# Altium project Z35.PrjPcb
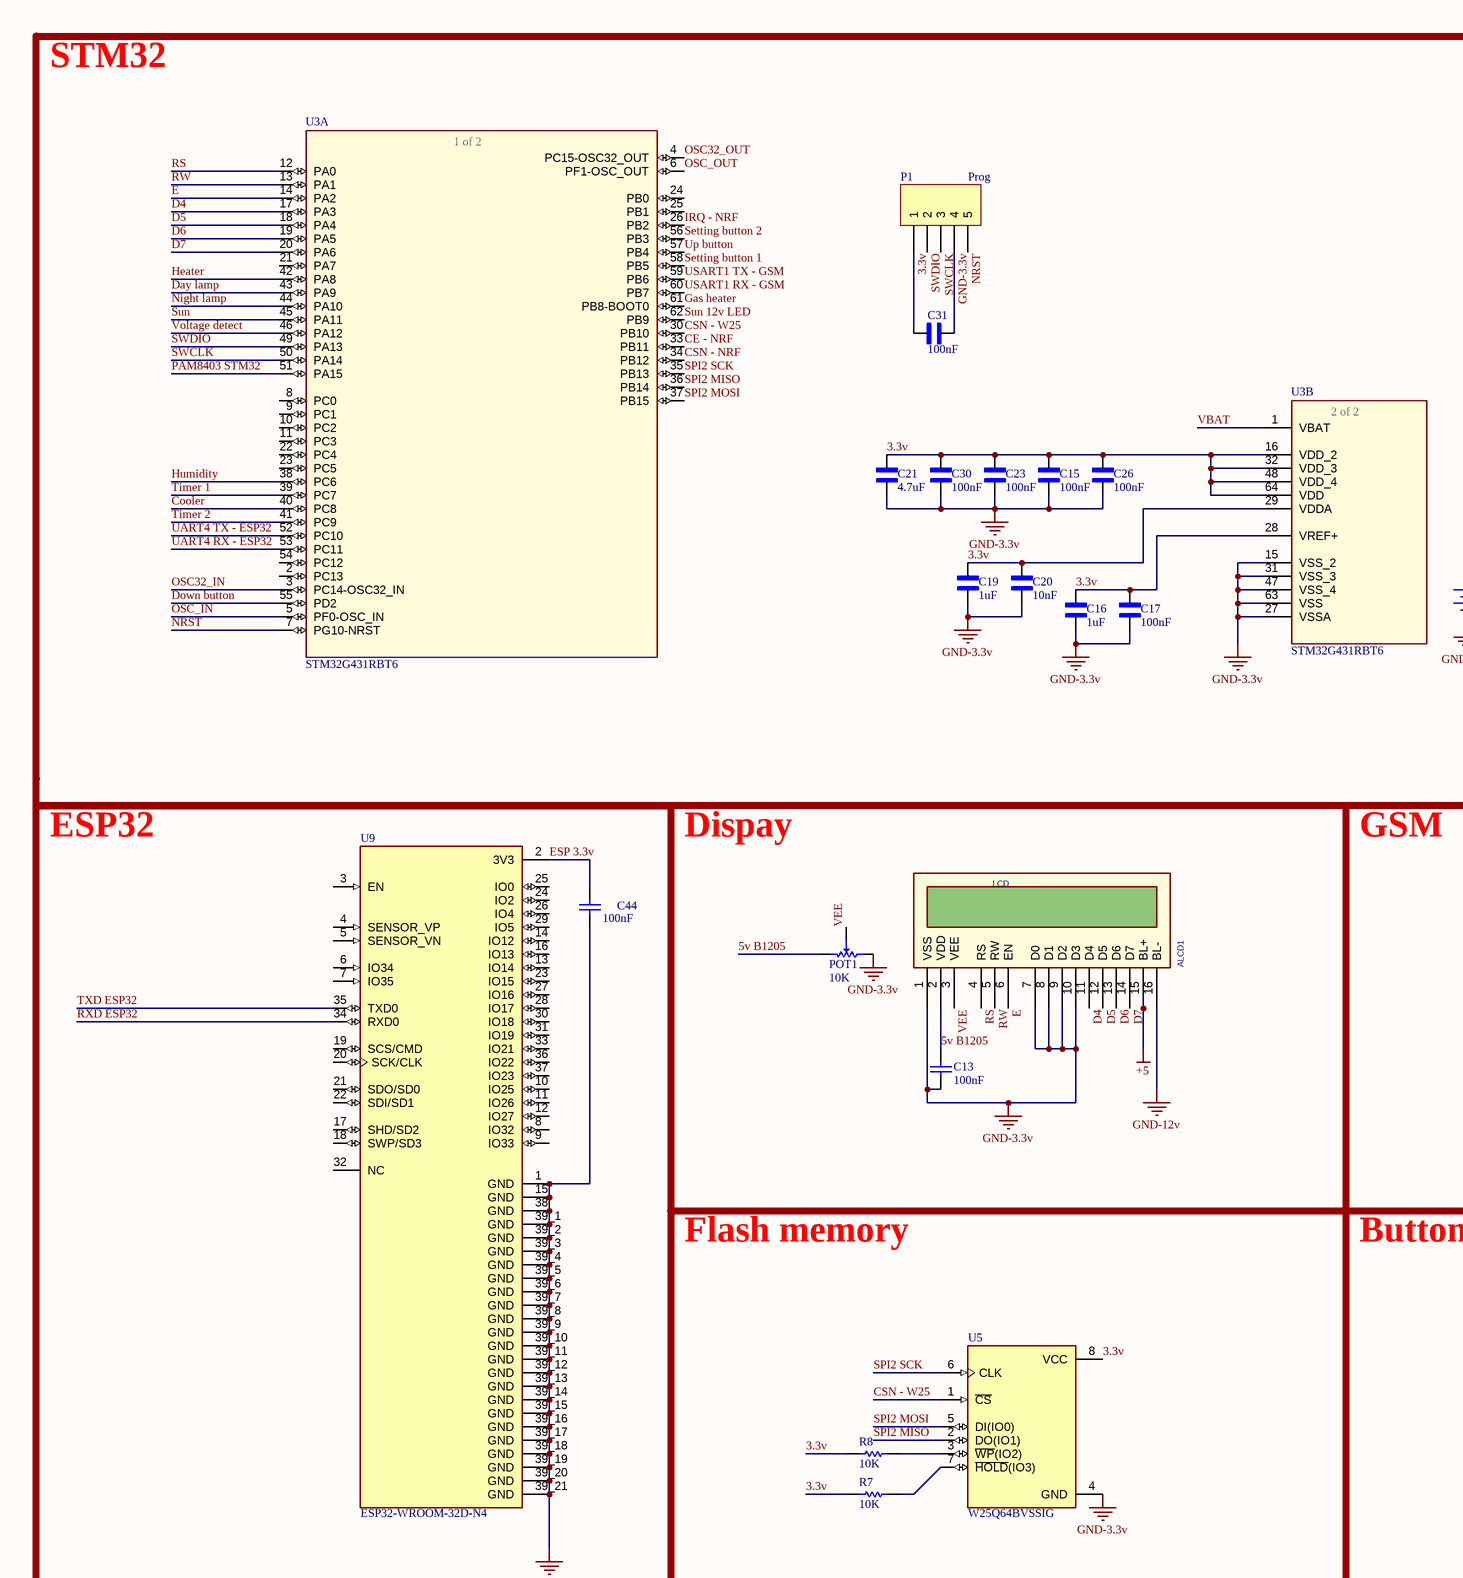
[diagram p0: Sch_Z35.SchDoc, top left]
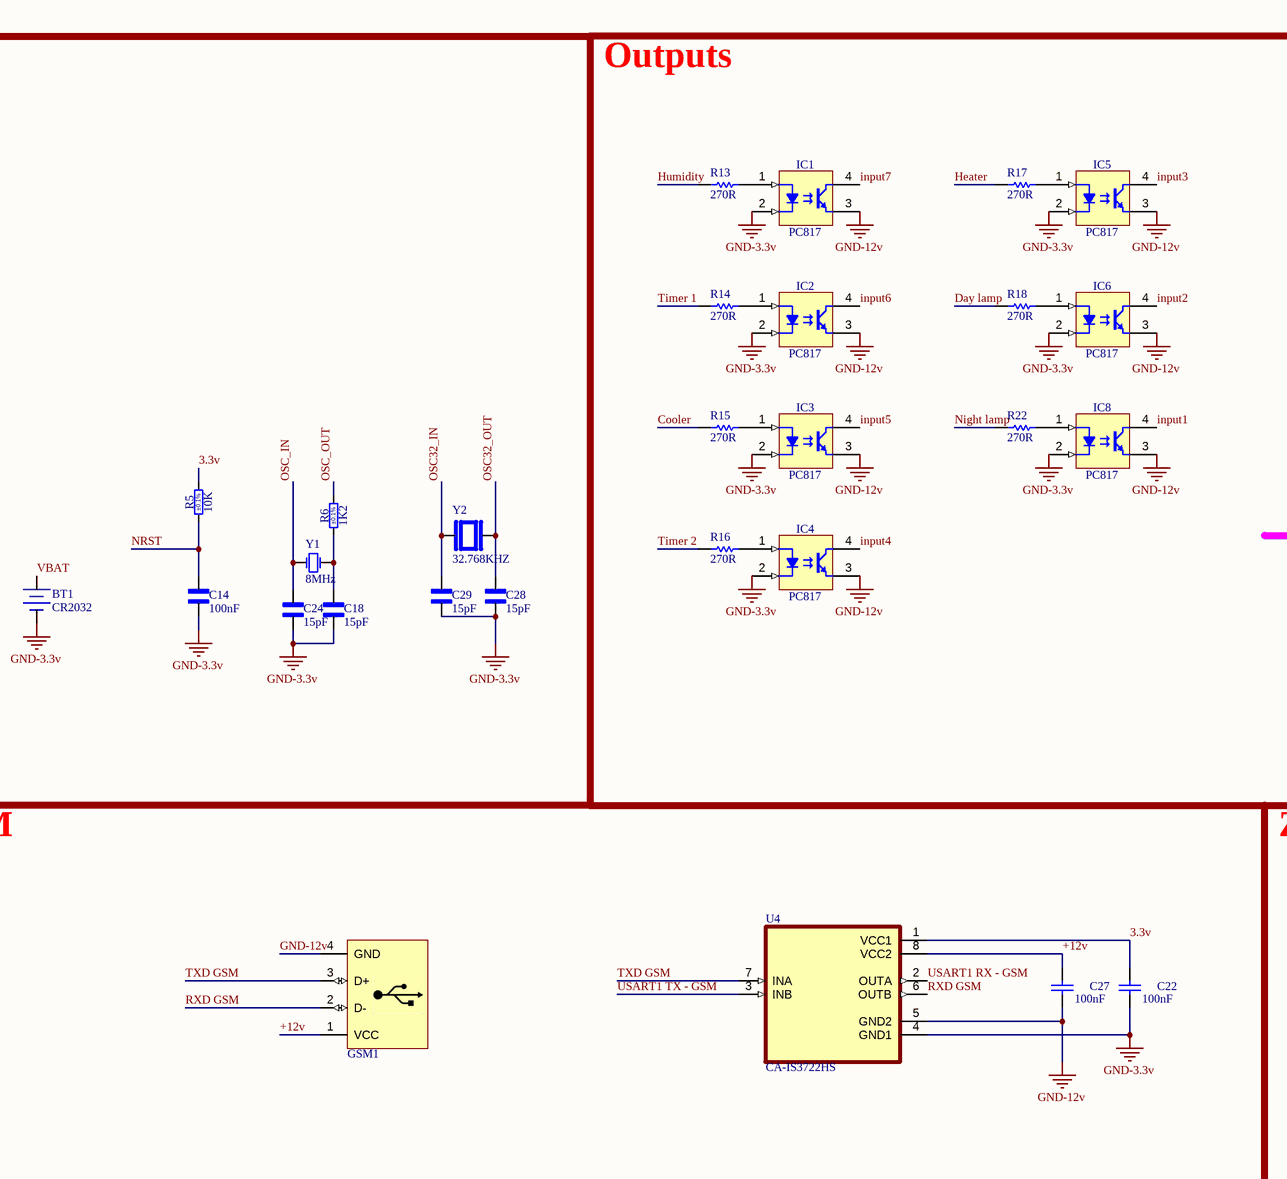
[diagram p1: Sch_Z35.SchDoc, top middle]
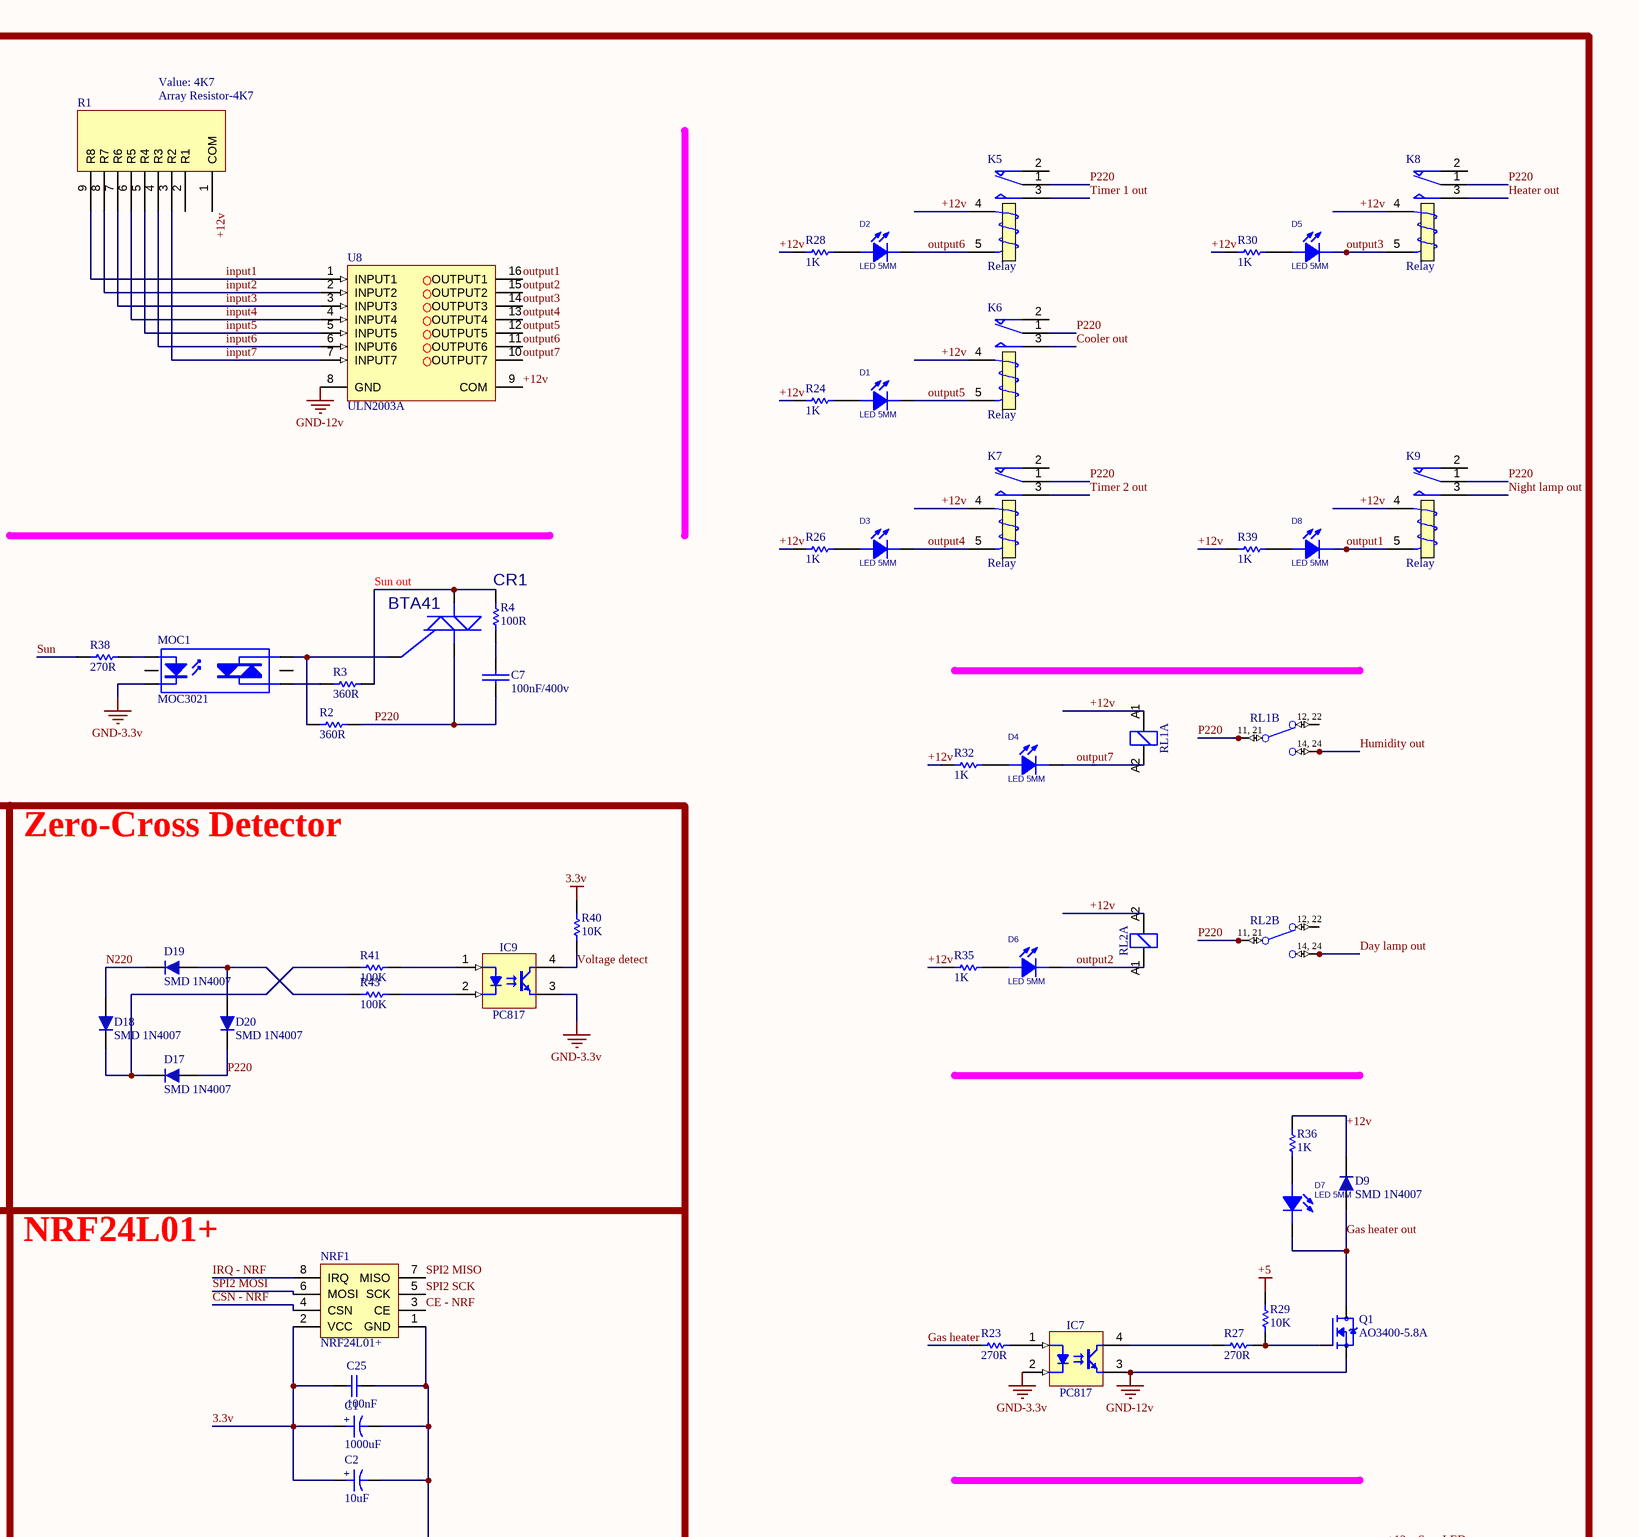
[diagram p2: Sch_Z35.SchDoc, top right]
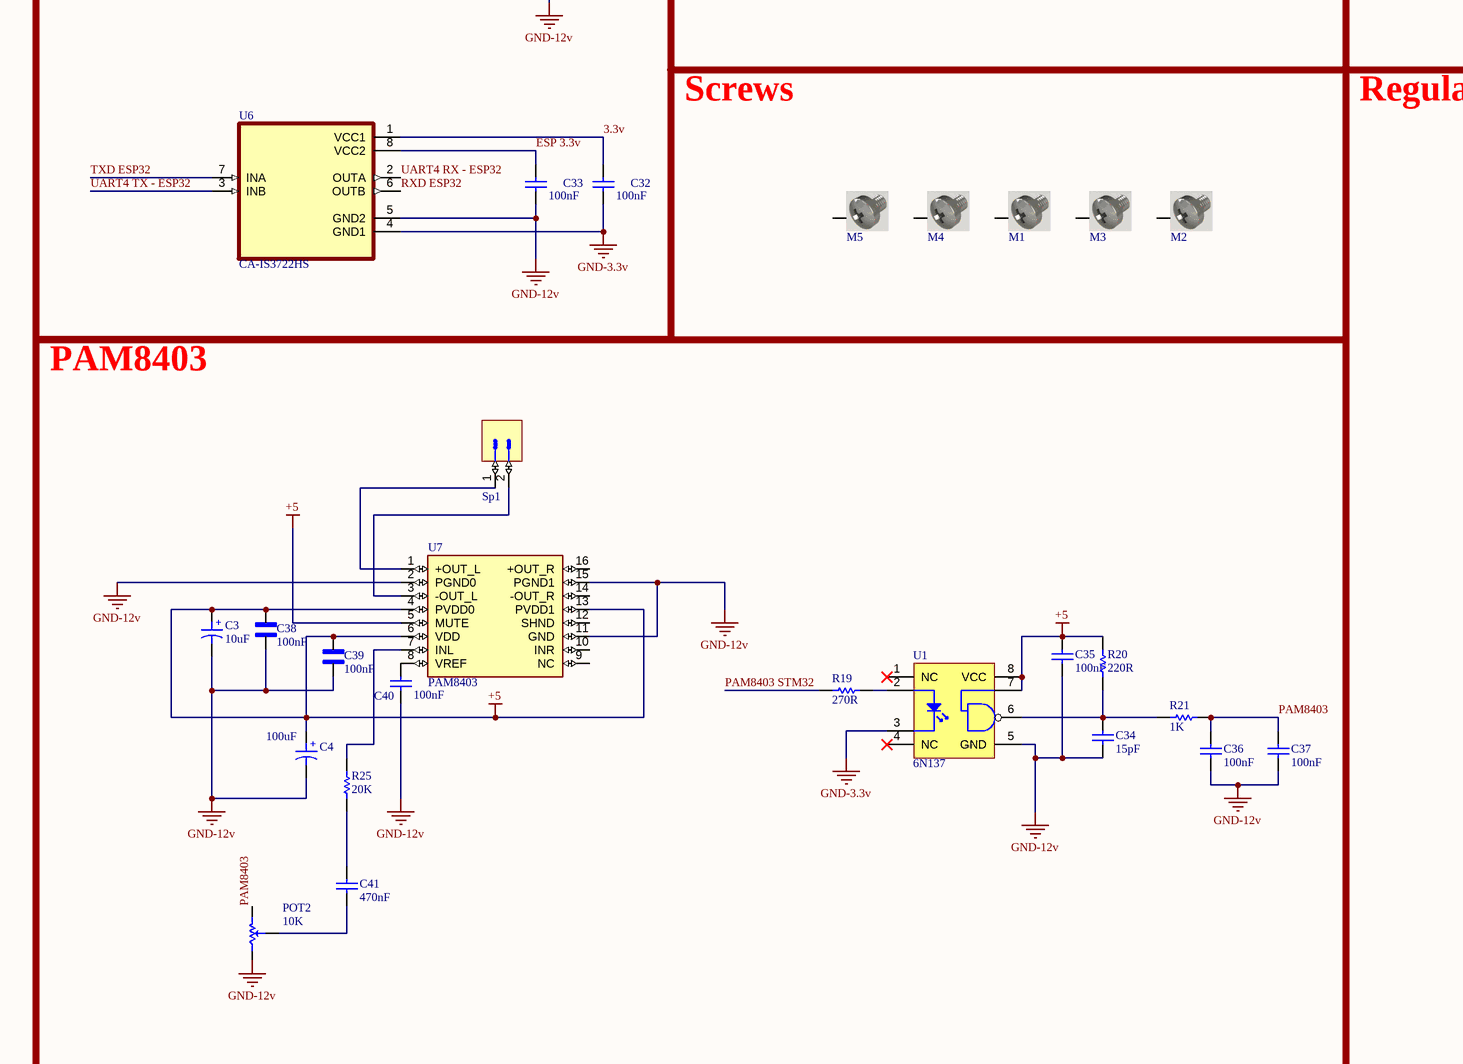
[diagram p3: Sch_Z35.SchDoc, bottom left]
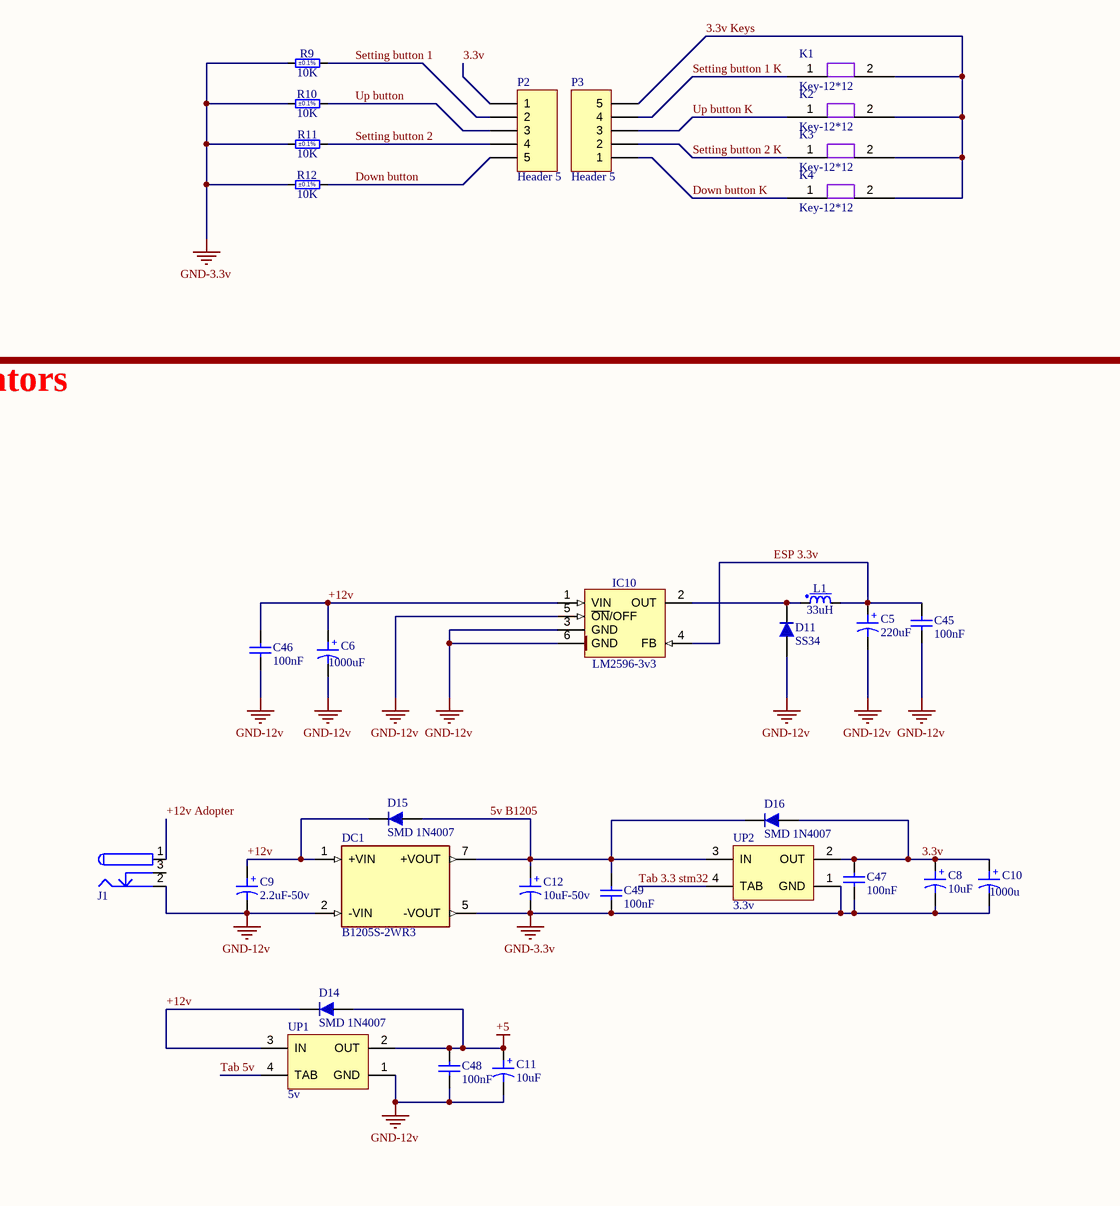
[diagram p4: Sch_Z35.SchDoc, bottom middle]
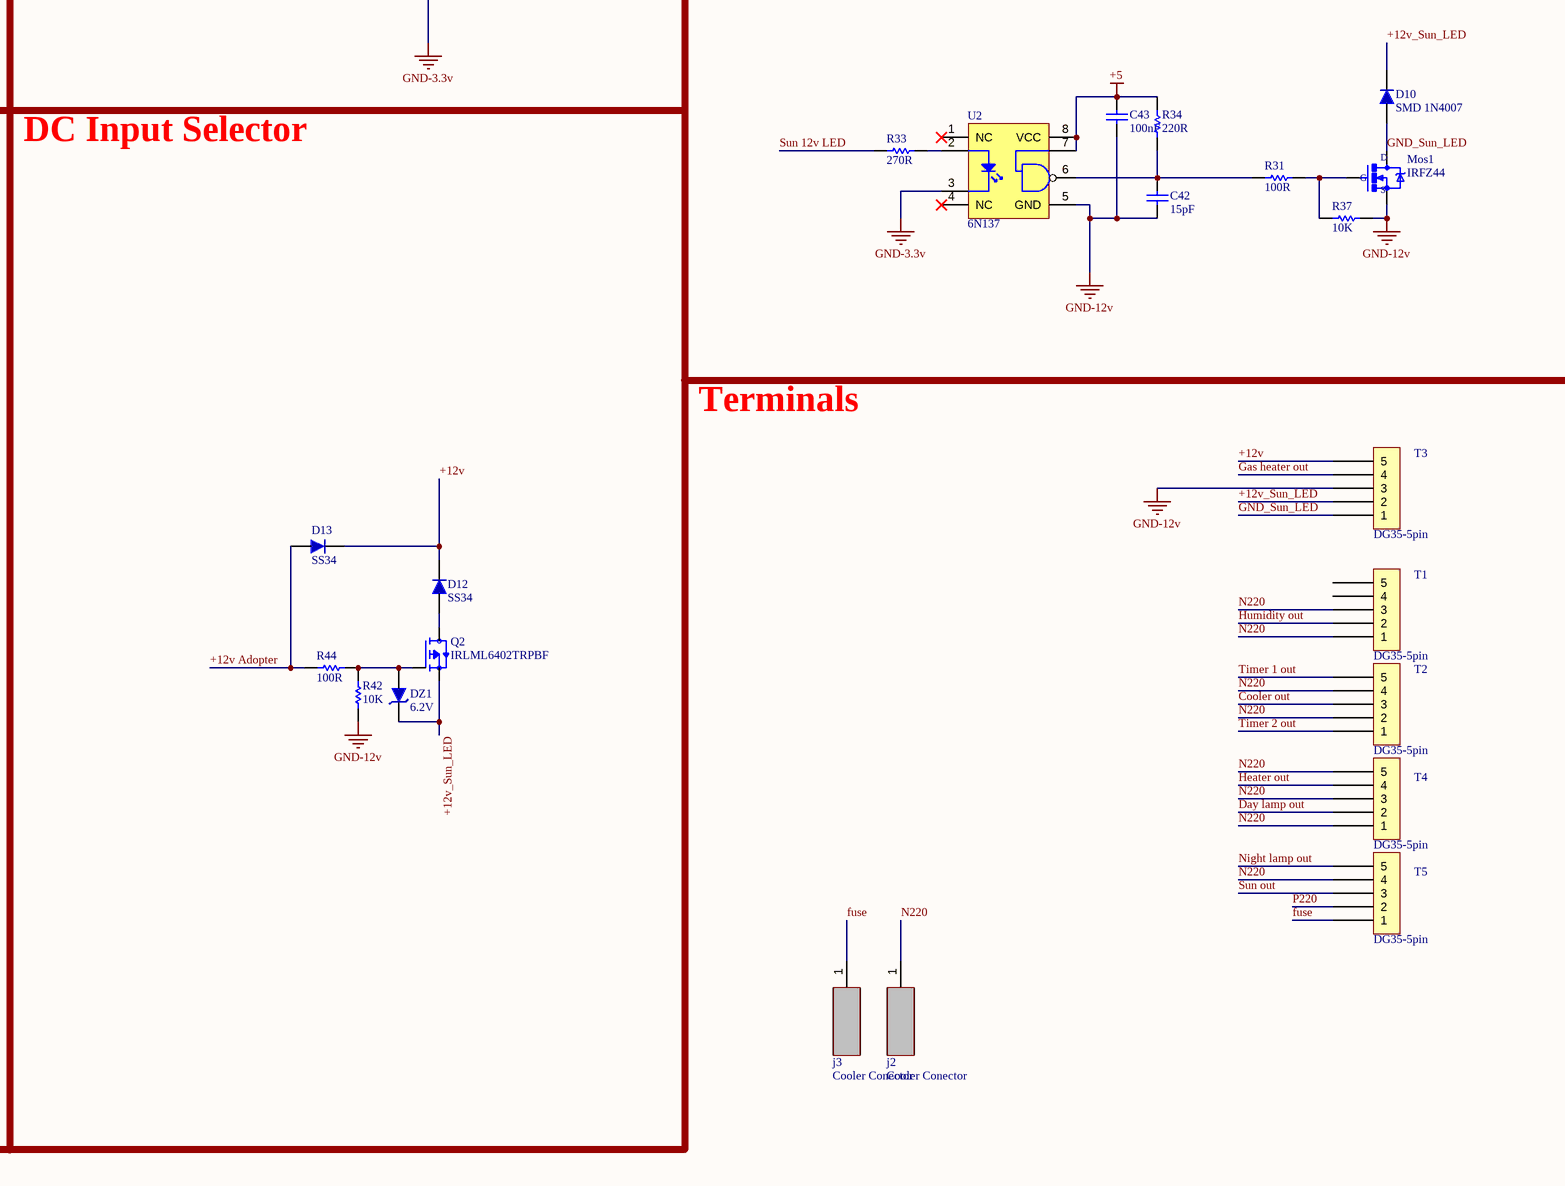
[diagram p5: Sch_Z35.SchDoc, bottom right]
Designer: Mohammadreza Zourmand
3 sheets, 279 parts. Net scope: global (net labels, ports and power ports of the same name join across sheets).
Board files: PCB_Z35.PcbDoc, PCB_Z35_Wireless_board.PcbDoc, PCB_Z35_Sensors.PcbDoc
Sheets:
  Sch_Z35.SchDoc
  Sch_Z35_Wireless_board.SchDoc
  Sch_Z35_Sensors.SchDoc

## Sheet Sch_Z35.SchDoc: Z35
size D; Author: Mohammadreza Zourmand; CompanyName: Daya; DrawnBy: Mohammadreza Zourmand; Engineer: Mohammadreza Zourmand; SheetNumber: 1; SheetTotal: 3; ProjectName: Birds Training

### Parts
(Parts that share a designator on the sheet are numbered #1, #2 ... from top to bottom, then left to right.)
ALCD1  LCD  [LCD 16x2]
BT1  CR2032  [BAT BACKUP]
C1  1000uF  [Cap electrolitic radial 8x14-3.5]
C2  10uF  [Cap electrolitic radial 6.3x12-2.5]
C3  10uF  [Cap electrolitic radial 4x7-1.5]
C4  100uF  [Cap electrolitic radial 4x7-1.5]
C5  220uF  [Cap electrolitic radial 6.3x12-2.5]
C6  1000uF  [Cap electrolitic radial 8x14-3.5]
C7  100nF/400v  [Cap - 100nF - 400V]
C8  10uF  [Cap electrolitic radial 6.3x12-2.5]
C9  2.2uF-50v  [Cap electrolitic radial 4x7-1.5]
C10  1000u  [Cap electrolitic radial 8x14-3.5]
C11  10uF  [Cap electrolitic radial 6.3x12-2.5]
C12  10uF-50v  [Cap electrolitic radial 4x7-1.5]
C13  100nF  [CAPC3413X12N]
C14  100nF  [CAPC1608X90]
C15  100nF  [CAPC1608X90]
C16  1uF  [CAPC1608X90]
C17  100nF  [CAPC1608X90]
C18  15pF  [CAPC1608X90]
C19  1uF  [CAPC1608X90]
C20  10nF  [CAPC1608X90]
C21  4.7uF  [CAPC1608X90]
C22  100nF  [CAPC3413X12N]
C23  100nF  [CAPC1608X90]
C24  15pF  [CAPC1608X90]
C25  100nF  [CAPC3413X12N]
C26  100nF  [CAPC1608X90]
C27  100nF  [CAPC3413X12N]
C28  15pF  [CAPC1608X90]
C29  15pF  [CAPC1608X90]
C30  100nF  [CAPC1608X90]
C31  100nF  [CAPC1608X90]
C32  100nF  [CAPC3413X12N]
C33  100nF  [CAPC3413X12N]
C34  15pF  [CAPC3413X12N]
C35  100nF  [CAPC3413X12N]
C36  100nF  [CAPC3413X12N]
C37  100nF  [CAPC3413X12N]
C38  100nF  [CAPC1608X90]
C39  100nF  [CAPC1608X90]
C40  100nF  [CAPC3413X12N]
C41  470nF  [CAPC3413X12N]
C42  15pF  [CAPC3413X12N]
C43  100nF  [CAPC3413X12N]
C44  100nF  [CAPC3413X12N]
C45  100nF  [CAPC3413X12N]
C46  100nF  [CAPC3413X12N]
C47  100nF  [CAPC3413X12N]
C48  100nF  [CAPC3413X12N]
C49  100nF  [CAPC3413X12N]
CR1  BTA41  [BTA41]
D1  LED 5MM  [LED5MM_YELLOW]
D2  LED 5MM  [LED5MM_YELLOW]
D3  LED 5MM  [LED5MM_YELLOW]
D4  LED 5MM  [LED5MM_YELLOW]
D5  LED 5MM  [LED5MM_YELLOW]
D6  LED 5MM  [LED5MM_YELLOW]
D7  LED 5MM  [LED5MM_YELLOW]
D8  LED 5MM  [LED5MM_YELLOW]
D9  SMD 1N4007  [DIODE SMD]
D10  SMD 1N4007  [DIODE SMD]
D11  SS34  [DIODE SMD]
D12  SS34  [DIODE SMD]
D13  SS34  [DIODE SMD]
D14  SMD 1N4007  [DIODE SMD]
D15  SMD 1N4007  [DIODE SMD]
D16  SMD 1N4007  [DIODE SMD]
D17  SMD 1N4007  [DIODE SMD]
D18  SMD 1N4007  [DIODE SMD]
D19  SMD 1N4007  [DIODE SMD]
D20  SMD 1N4007  [DIODE SMD]
DC1  B1205S-2WR3  [CONV_RKZE-1205S/HP]
DZ1  6.2V  [SOD80, LL-34]
GSM1  USB Connector  [USB2.5-2H4C]  (value not drawn)
IC1  PC817  [WURTH_140817143400]
IC2  PC817  [WURTH_140817143400]
IC3  PC817  [WURTH_140817143400]
IC4  PC817  [WURTH_140817143400]
IC5  PC817  [WURTH_140817143400]
IC6  PC817  [WURTH_140817143400]
IC7  PC817  [WURTH_140817143400]
IC8  PC817  [WURTH_140817143400]
IC9  PC817  [WURTH_140817143400]
IC10  LM2596-3v3  [TO170P1435X465-6N-R1041X635]
J1  DC Power Jack  [DC Power Jack 1]  (value not drawn)
j2  Cooler Conector  [Cooler Conector]
j3  Cooler Conector  [Cooler Conector]
K1  Key-12*12  [Switch_11_11]
K2  Key-12*12  [Switch_11_11]
K3  Key-12*12  [Switch_11_11]
K4  Key-12*12  [Switch_11_11]
K5  Relay  [Relay 18.85x15.35x15.70]
K6  Relay  [Relay 18.85x15.35x15.70]
K7  Relay  [Relay 18.85x15.35x15.70]
K8  Relay  [Relay 18.85x15.35x15.70]
K9  Relay  [Relay 18.85x15.35x15.70]
L1  33uH  [IND_PANASONIC_ELL6RH]
M1  Screw3mm  [Board Screw 3mm]  (value not drawn)
M2  Screw3mm  [Board Screw 3mm]  (value not drawn)
M3  Screw3mm  [Board Screw 3mm]  (value not drawn)
M4  Screw3mm  [Board Screw 3mm]  (value not drawn)
M5  Screw3mm  [Board Screw 3mm]  (value not drawn)
MOC1  MOC3021  [DIP-6]
Mos1  IRFZ44  [TO-220]
NRF1  NRF24L01+  [NRF24L01P]
P1  Prog  [HDR1X5]
P2  Header 5  [HDR1X5]
P3  Header 5  [HDR1X5]
POT1  10K  [POT 4]
POT2  10K  [POT 4]
Q1#1  AO3400-5.8A  [SOT95P260X140-3N]
Q2  IRLML6402TRPBF  [SOT95P237X112-3N]
R1  Array Resistor-4K7  value 4K7  [Res Array]
R2  360R  [Axial 0_25 W, 0_4 IN LEAD PITCH]
R3  360R  [Axial 0_25 W, 0_4 IN LEAD PITCH]
R4  100R  [Axial 0_25 W, 0_4 IN LEAD PITCH]
R5  10K  Tolerance: ±0.1%  [RESC1608X55N]
R6  1K2  Tolerance: ±0.1%  [RESC1608X55N]
R7  10K  [RESC3413X04N]
R8  10K  [RESC3413X04N]
R9  10K  Tolerance: ±0.1%  [RESC1608X55N]
R10  10K  Tolerance: ±0.1%  [RESC1608X55N]
R11  10K  Tolerance: ±0.1%  [RESC1608X55N]
R12  10K  Tolerance: ±0.1%  [RESC1608X55N]
R13  270R  [RESC3413X04N]
R14  270R  [RESC3413X04N]
R15  270R  [RESC3413X04N]
R16  270R  [RESC3413X04N]
R17  270R  [RESC3413X04N]
R18  270R  [RESC3413X04N]
R19  270R  [RESC3413X04N]
R20  220R  [RESC3413X04N]
R21  1K  [RESC3413X04N]
R22  270R  [RESC3413X04N]
R23  270R  [RESC3413X04N]
R24  1K  [RESC4817X04N]
R25  20K  [RESC3413X04N]
R26  1K  [RESC4817X04N]
R27  270R  [RESC3413X04N]
R28  1K  [RESC4817X04N]
R29  10K  [RESC3413X04N]
R30  1K  [RESC4817X04N]
R31  100R  [RESC3413X04N]
R32  1K  [RESC4817X04N]
R33  270R  [RESC3413X04N]
R34  220R  [RESC3413X04N]
R35  1K  [RESC4817X04N]
R36  1K  [RESC4817X04N]
R37  10K  [RESC3413X04N]
R38  270R  [RESC3413X04N]
R39  1K  [RESC4817X04N]
R40  10K  [RESC3413X04N]
R41  100K  [RESC4817X04N]
R42  10K  [RESC3413X04N]
R43  100K  [RESC4817X04N]
R44  100R  [RESC3413X04N]
RL1  REL_FINDER_40.61  [REL_FINDER_40.61]  (value not drawn)  (parts A,B of 2)
RL2  REL_FINDER_40.61  [REL_FINDER_40.61]  (value not drawn)  (parts A,B of 2)
Sp1  KK®  [MOLEX_22-04-1021]  (value not drawn)
T1  DG35-5pin  [DG35-5pin]
T2  DG35-5pin  [DG35-5pin]
T3  DG35-5pin  [DG35-5pin]
T4  DG35-5pin  [DG35-5pin]
T5  DG35-5pin  [DG35-5pin]
U1  6N137  [DIP8]
U2  6N137  [DIP8]
U3  STM32G431RBT6  [LQFP64-10X10MM]  (parts A,B of 2)
U4  CA-IS3722HS  [SOIC127P599X175-8N]
U5  W25Q64BVSSIG  [SOIC127P790X216-8N]
U6  CA-IS3722HS  [SOIC127P599X175-8N]
U7  PAM8403  [SOP-16]
U8  ULN2003A  [SO16_M]
U9  ESP32-WROOM-32D-N4  [MODULE_ESP32-WROOM-32D-N4]
UP1  5v  [SOT223]
UP2  3.3v  [SOT223]
Y1  8MHz  [Crystal SMD]
Y2  32.768KHZ  [XTAL_ABS09-32.768KHZ-T]

### Blocks framed on the sheet
ESP32: C32 C33 C44 U6 U9

### Nets
3.3v: C1.1 C2.1 C8.1 C10.1 C15.1 C16.1 C17.1 C19.1 C20.1 C21.1 C22.1 C23.1 C25.2 C26.1 C30.1 C31.1 C32.1 C47.1 D16.1 NRF1.2(VCC) P1.1 P2.1 R5.2 R7.2 R8.2 R40.1 U3.16(VDD_2) U3.28(VREF+) U3.29(VDDA) U3.32(VDD_3) U3.48(VDD_4) U3.64(VDD) U4.1(VCC1) U5.8(VCC) U6.1(VCC1) UP2.2(OUT)
+5: ALCD1.15(BL+) C3.1 C4.1 C11.1 C35.1 C38.1 C39.1 C43.1 C48.1 D14.1 R20.2 R29.2 R34.2 U1.7(Ve) U1.8(VCC) U2.7(Ve) U2.8(VCC) U7.4(PVDD0) U7.5(MUTE) U7.6(VDD) U7.13(PVDD1) UP1.2(OUT)
GND-3.3v: ALCD1.1(VSS) ALCD1.7(D0) ALCD1.8(D1) ALCD1.9(D2) ALCD1.10(D3) BT1.2(-) C1.2 C2.2 C8.2 C10.2 C12.2 C13.2 C14.2 C15.2 C16.2 C17.2 C18.2 C19.2 C20.2 C21.2 C22.2 C23.2 C24.2 C25.1 C26.2 C28.2 C29.2 C30.2 C31.2 C32.2 C47.2 C49.2 DC1.5(-VOUT) IC1.2(C) IC2.2(C) IC3.2(C) IC4.2(C) IC5.2(C) IC6.2(C) IC7.2(C) IC8.2(C) IC9.3(E) MOC1.2(K) NRF1.1(GND) P1.4 POT1.1(CCW) R9.1 R10.1 R11.1 R12.1 U1.3(K) U2.3(K) U3.15(VSS_2) U3.27(VSSA) U3.31(VSS_3) U3.47(VSS_4) U3.63(VSS) U4.4(GND1) U5.4(GND) U6.4(GND1) UP2.1(GND)
GND-12v: ALCD1.16(BL-) C3.2 C4.2 C5.2 C6.2 C9.2 C11.2 C27.2 C33.2 C34.2 C35.2 C36.2 C37.2 C38.2 C39.2 C40.2 C42.2 C43.2 C44.2 C45.2 C46.2 C48.2 D11.1 DC1.2(-VIN) GSM1.4(GND) IC1.3(E) IC2.3(E) IC3.3(E) IC4.3(E) IC5.3(E) IC6.3(E) IC7.3(E) IC8.3(E) IC10.3(GND) IC10.5(~{ON}/OFF) IC10.6(GND) J1.2 Mos1.3(S) POT2.1(CCW) Q1#1.2(S) R37.1 R42.2 T3.3 U1.5(GND) U2.5(GND) U4.5(GND2) U6.5(GND2) U7.2(PGND0) U7.11(GND) U7.15(PGND1) U8.8(GND) U9.1(GND) U9.15(GND) U9.38(GND) U9.39_1(GND) U9.39_2(GND) U9.39_3(GND) U9.39_4(GND) U9.39_5(GND) U9.39_6(GND) U9.39_7(GND) U9.39_8(GND) U9.39_9(GND) U9.39_10(GND) U9.39_11(GND) U9.39_12(GND) U9.39_13(GND) U9.39_14(GND) U9.39_15(GND) U9.39_16(GND) U9.39_17(GND) U9.39_18(GND) U9.39_19(GND) U9.39_20(GND) U9.39_21(GND) UP1.1(GND)
3.3v Keys: K1.2 K2.2 K3.2 K4.2 P3.5
5v B1205: ALCD1.2(VDD) C12.1 C13.1 C49.1 D15.1 D16.2 DC1.7(+VOUT) POT1.2(CW) UP2.3(IN)
+12v: C6.1 C9.1 C27.1 C46.1 D9.2 D12.2 D13.2 D14.2 D15.2 DC1.1(+VIN) GSM1.1(VCC) IC10.1(VIN) K5.4(T1) K6.4(T1) K7.4(T1) K8.4(T1) K9.4(T1) R1.1(COM) R24.1 R26.1 R28.1 R30.1 R32.1 R35.1 R36.2 R39.1 RL1.A1(COIL) RL2.A2(COIL) T3.5 U4.8(VCC2) U8.9(COM) UP1.3(IN)
+12v Adopter: D13.1 J1.1 R44.2
+12v_Sun_LED: D10.2 DZ1.2 Q2.2(S) T3.2
CE - NRF: NRF1.3(CE) U3.33(PB11)
Cooler: R15.2 U3.40(PC8)
Cooler out: K6.3(NO) T2.3
CSN - NRF: NRF1.4(CSN) U3.34(PB12)
CSN - W25: U3.30(PB10) U5.1(~{CS})
D4: ALCD1.11(D4) U3.17(PA3)
D5: ALCD1.12(D5) U3.18(PA4)
D6: ALCD1.13(D6) U3.19(PA5)
D7: ALCD1.14(D7) U3.20(PA6)
Day lamp: R18.2 U3.43(PA9)
Day lamp out: RL2.14(NO) RL2.24(NO) T4.2
Down button: P2.5 R12.2 U3.55(PD2)
Down button K: K4.1 P3.1
E: ALCD1.6(EN) U3.14(PA2)
ESP 3.3v: C5.1 C33.1 C44.1 C45.1 IC10.4(FB) L1.2 U6.8(VCC2) U9.2(3V3)
fuse: j3.1 T5.1
Gas heater: R23.2 U3.61(PB8-BOOT0)
Gas heater out: D7.2(CATHODE) D9.1 Q1#1.3(D) T3.4
GND_Sun_LED: D10.1 Mos1.2(D) T3.1
Heater: R17.2 U3.42(PA8)
Heater out: K8.3(NO) T4.4
Humidity: R13.2 U3.38(PC6)
Humidity out: RL1.14(NO) RL1.24(NO) T1.2
input1: IC8.4(C) R1.9(R8) U8.1(INPUT1)
input2: IC6.4(C) R1.8(R7) U8.2(INPUT2)
input3: IC5.4(C) R1.7(R6) U8.3(INPUT3)
input4: IC4.4(C) R1.6(R5) U8.4(INPUT4)
input5: IC3.4(C) R1.5(R4) U8.5(INPUT5)
input6: IC2.4(C) R1.4(R3) U8.6(INPUT6)
input7: IC1.4(C) R1.3(R2) U8.7(INPUT7)
IRQ - NRF: NRF1.8(IRQ) U3.26(PB2)
N220: D18.1 D19.2 j2.1 T1.1 T1.3 T2.2 T2.4 T4.1 T4.3 T4.5 T5.4
Night lamp: R22.2 U3.44(PA10)
Night lamp out: K9.3(NO) T5.5
NRST: C14.1 P1.5 R5.1 U3.7(PG10-NRST)
OSC32_IN: C29.1 U3.3(PC14-OSC32_IN) Y2.2
OSC32_OUT: C28.1 U3.4(PC15-OSC32_OUT) Y2.1
OSC_IN: C24.1 U3.5(PF0-OSC_IN) Y1.1(OSC1)
OSC_OUT: R6.2 U3.6(PF1-OSC_OUT)
output1: D8.2(CATHODE) K9.5(T2) U8.16(OUTPUT1)
output2: D6.2(CATHODE) RL2.A1(COIL) U8.15(OUTPUT2)
output3: D5.2(CATHODE) K8.5(T2) U8.14(OUTPUT3)
output4: D3.2(CATHODE) K7.5(T2) U8.13(OUTPUT4)
output5: D1.2(CATHODE) K6.5(T2) U8.12(OUTPUT5)
output6: D2.2(CATHODE) K5.5(T2) U8.11(OUTPUT6)
output7: D4.2(CATHODE) RL1.A2(COIL) U8.10(OUTPUT7)
P220: C7.2(-) CR1.1(A1) D17.1 D20.2 K5.1(COM) K6.1(COM) K7.1(COM) K8.1(COM) K9.1(COM) R2.2 RL1.11(C) RL1.21(C) RL2.11(C) RL2.21(C) T5.2
PAM8403: C36.1 C37.1 POT2.2(CW) R21.1
PAM8403 STM32: R19.2 U3.51(PA15)
RS: ALCD1.4(RS) U3.12(PA0)
RW: ALCD1.5(RW) U3.13(PA1)
RXD ESP32: U6.6(OUTB) U9.34(RXD0)
RXD GSM: GSM1.2(D-) U4.6(OUTB)
Setting button 1: P2.2 R9.2 U3.58(PB5)
Setting button 1 K: K1.1 P3.4
Setting button 2: P2.4 R11.2 U3.56(PB3)
Setting button 2 K: K3.1 P3.2
SPI2 MISO: NRF1.7(MISO) U3.36(PB14) U5.2(DO(IO1))
SPI2 MOSI: NRF1.6(MOSI) U3.37(PB15) U5.5(DI(IO0))
SPI2 SCK: NRF1.5(SCK) U3.35(PB13) U5.6(CLK)
Sun: R38.2 U3.45(PA11)
Sun 12v LED: R33.2 U3.62(PB9)
Sun out: CR1.2(A2) R3.2 R4.2 T5.3
SWCLK: P1.3 U3.50(PA14)
SWDIO: P1.2 U3.49(PA13)
Tab 3.3 stm32: UP2.4(TAB)
Tab 5v: UP1.4(TAB)
Timer 1: R14.2 U3.39(PC7)
Timer 1 out: K5.3(NO) T2.5
Timer 2: R16.2 U3.41(PC9)
Timer 2 out: K7.3(NO) T2.1
TXD ESP32: U6.7(INA) U9.35(TXD0)
TXD GSM: GSM1.3(D+) U4.7(INA)
UART4 RX - ESP32: U3.53(PC11) U6.2(OUTA)
UART4 TX - ESP32: U3.52(PC10) U6.3(INB)
Up button: P2.3 R10.2 U3.57(PB4)
Up button K: K2.1 P3.3
USART1 RX - GSM: U3.60(PB7) U4.2(OUTA)
USART1 TX - GSM: U3.59(PB6) U4.3(INB)
VBAT: BT1.1(+) U3.1(VBAT)
VEE: ALCD1.3(VEE) POT1.3(SetPoint)
Voltage detect: IC9.4(C) R40.2 U3.46(PA12)
NetC7_1: C7.1(+) R4.1
NetC18_1: C18.1 R6.1 Y1.2(OSC2)
NetC34_1: C34.1 R20.1 R21.2 U1.6(Vo)
NetC40_1: C40.1 U7.8(VREF)
NetC41_1: C41.1 R25.1
NetC41_2: C41.2 POT2.3(SetPoint)
NetC42_1: C42.1 R31.2 R34.1 U2.6(Vo)
NetCR1_3: CR1.3(G) MOC1.4(A/K) R2.1
NetD1_1: D1.1(ANODE) R24.2
NetD2_1: D2.1(ANODE) R28.2
NetD3_1: D3.1(ANODE) R26.2
NetD4_1: D4.1(ANODE) R32.2
NetD5_1: D5.1(ANODE) R30.2
NetD6_1: D6.1(ANODE) R35.2
NetD7_1: D7.1(ANODE) R36.1
NetD8_1: D8.1(ANODE) R39.2
NetD11_2: D11.2 IC10.2(OUT) L1.1
NetD12_1: D12.1 Q2.3(D)
NetD17_2: D17.2 D18.2 R41.1
NetD19_1: D19.1 D20.1 R43.1
NetDZ1_1: DZ1.1 Q2.1(G) R42.1 R44.1
NetIC1_1: IC1.1(A) R13.1
NetIC2_1: IC2.1(A) R14.1
NetIC3_1: IC3.1(A) R15.1
NetIC4_1: IC4.1(A) R16.1
NetIC5_1: IC5.1(A) R17.1
NetIC6_1: IC6.1(A) R18.1
NetIC7_1: IC7.1(A) R23.1
NetIC7_4: IC7.4(C) R27.1
NetIC8_1: IC8.1(A) R22.1
NetIC9_1: IC9.1(A) R41.2
NetIC9_2: IC9.2(C) R43.2
NetMOC1_1: MOC1.1(A) R38.1
NetMOC1_6: MOC1.6(A/K) R3.1
NetMos1_1: Mos1.1(G) R31.1 R37.2
NetQ1#1_1: Q1#1.1(G) R27.2 R29.1
NetR7_1: R7.1 U5.7(~{HOLD}(IO3))
NetR8_1: R8.1 U5.3(~{WP}(IO2))
NetR19_1: R19.1 U1.2(A)
NetR25_2: R25.2 U7.7(INL)
NetR33_1: R33.1 U2.2(A)
NetRL1_12: RL1.12(NC) RL1.22(NC)
NetRL2_12: RL2.12(NC) RL2.22(NC)
NetSp1_1: Sp1.1 U7.1(+OUT_L)
NetSp1_2: Sp1.2 U7.3(-OUT_L)

Not connected (* = marked no-connect by the designer): J1 3; K5 2(NC); K6 2(NC); K7 2(NC); K8 2(NC); K9 2(NC); M1 S; M2 S; M3 S; M4 S; M5 S; MOC1 3(NC) 5(NC); R1 2(R1); T1 4 5; U1 1(NC)* 4(NC)*; U2 1(NC)* 4(NC)*; U3 2(PC13) 8(PC0) 9(PC1) 10(PC2) 11(PC3) 21(PA7) 22(PC4) 23(PC5) 24(PB0) 25(PB1) 54(PC12); U7 9(NC) 10(INR) 12(SHND) 14(-OUT_R) 16(+OUT_R); U9 3(EN) 4(SENSOR_VP) 5(SENSOR_VN) 6(IO34) 7(IO35) 8(IO32) 9(IO33) 10(IO25) 11(IO26) 12(IO27) 13(IO14) 14(IO12) 16(IO13) 17(SHD/SD2) 18(SWP/SD3) 19(SCS/CMD) 20(SCK/CLK) 21(SDO/SD0) 22(SDI/SD1) 23(IO15) 24(IO2) 25(IO0) 26(IO4) 27(IO16) 28(IO17) 29(IO5) 30(IO18) 31(IO19) 32(NC) 33(IO21) 36(IO22) 37(IO23)

### Notes on the sheet
- STM32
- Outputs
- Dispay
- GSM
- Zero-Cross Detector
- Flash memory
- Buttons
- NRF24L01+
- Screws
- Regulators
- DC Input Selector
- PAM8403
- Terminals
- DWG. NO.
- REV.
- SHT.
- REVISION
- DESCRIPTION
- DATE
- APPROVED
- THIS DOCUMENT AND THE DATA DISCLOSED HEREIN OR HEREWITH IS THE PROPERTY OF ALTIUM LIMITED AND MAY BE FREELY DISTRIBUTED IN WHOLE. NO RIGHTS ARE RESERVED OR EXPRESS OR IMPLIED WARANTEE GIVEN.
- ENG:
- DSN:
- APPROVALS
- PROJECT
- DOCUMENT REVISION:
- DESIGN ITEM:
- CHK:
- BOM:
- REFERENCE DOCUMENTS
- PROJECT REVISION:
- TITLE
- FAB DWG:
- PCB DWG:
- ASSY DWG:
- SCALE:
- SIZE
- D
- CAGE CODE
- FILE NAME
- DWG NO.
- SHEET
- OF
- REV
- (in symbol Cap ELECTROLITIC TOTAL SIZE) +
- (in symbol REL_FINDER_40.61.9.009.0000, part B) 12, 22; 11, 21; 14, 24
- (in symbol STM32G431RBT6, part A) 1 of 2
- (in symbol STM32G431RBT6, part B) 2 of 2

### Library data of the parts
ALCD1 = LCD: Alphanumic LCD; Designer: Abbas Basereh; Data: 16-12-2016
BT1 = Battry Backup: Designer: Abbas Basereh; Data: 16-12-2016; Link: *; Part. No: *
C1-C6 C8-C12 = Cap ELECTROLITIC TOTAL SIZE: Cap electrolitic radial; Designer: Abbas Basereh; VALUE: 1uF; Data: 16-12-2016; Part. No: *
C7 = Cap-Bipolar: Bipolar Capacitor; Voltage: 100V; Designer: Saeid Jorablo; Organazation: ControTec; Adding Date: 1387/12/20; Value: 100nF/400v
C13 C22 C25 C27 C32-C37 C40-C49 = CAP SMD 0805: CAP 0805; Designer: Abbas Basereh; Desc.: CAP SMD 0805; Data: 16-12-2016
C14-C21 C23 C24 C26 C28-C31 C38 C39 = Cap 0603: 0603 C 100nF Ceramic Multilayer Capacitor, 25 V, +125degC, X7R Dielectric, +/-5% | KEMET C0603C104J3RACTU; SnapEDA_Link: https://www.snapeda.com/parts/C0603C104J3RACTU/KEMET/view-part/?ref=snap; Package: 603-2 KEMET; Value: *; MF: KEMET; MP: C0603C104J3RACTU; Check_prices: https://www.snapeda.com/parts/C0603C104J3RACTU/KEMET/view-part/?ref=eda
CR1 = BTA41: Manufacturer_Part_Number: BTA41-600BRG; C: Copyright (C) 2015 Accelerated Designs. All rights reserved; Vendor: STMicroelectronics; Built_By: EMA_UL_Team; SourceLibrary: StMicro_2011-06-07
D1-D8 = LED 5MM: Light Emitting Diode; Designer: Abbas Basereh; Data: 16-12-2016; Link: *; Part.No: *
D9-D20 = Diode SMD Package: Diode SMD Pakage
DC1 = B1205S-2WR3: 2W, constant voltage input, isolated ,unregulated single output, DC DC power module; MP: RKZE-1205S/HP; Package: None; Price: None; Value: *; Availability: Unavailable
DZ1 = ZENER GENERAL DIODE: DIODE ZENER GENERAL; VALUE: 12V; Published: 2017-1-12; PackageVersion: 2017-1-12; PackageReference: DO 35; Publisher: Abbas Basereh; PackageDescription: DIODE GEN ZENER; ComponentLink1Description: Manufacturer Link; ComponentLink2Description: Datasheet
GSM1 = USB A-Type: USB Connector-A Type
IC1-IC9 = 140817143400: Single Optocoupler-PC817; Part Description: WL-OCPT Optocoupler Phototransistor; Manufacturer: WURTH; PressFit: No; Bonding: No; Part Number: 140817143400; Component Kind: Standard; Component Type: Standard; Device: 140817143400; PackageDescription: DIP Gull Wing Surface Mount, 2.54mm Pitch; 4 Pin, 6.5mm W X 4.58mm L X 3.9mm H body, WURTH; Manufacturer Part Number: 140817143400; Pin Count: 4; Case: DIP4 SMD; Mounted: Yes; Socket: No; SMD: Yes; Sense: No; ComponentHeight: 3.9mm; HelpURL: \\cern.ch\dfs\Applications\Altium\Datasheets\WURTH_140817143400.pdf; Author: CERN DEM HF; CreateDate: 4/5/2023; LatestRevisionDate: 4/5/2023
IC10 = LM2596S-5.0/NOPB: SIMPLE SWITCHER® Power Converter 150kHz, 3A Step-Down Voltage Regulator; Part Description: 4.5V to 40V Input to 5V Output, SIMPLE SWITCHER® Power Converter 150kHz, 3A Step-Down Voltage Regulator; Manufacturer: TEXAS INSTRUMENTS; PressFit: No; Bonding: No; Part Number: LM2596S-5.0/NOPB; Component Kind: Standard; Component Type: Standard; Device: LM2596S-5.0/NOPB; PackageDescription: D2PAK TO-263, TO, 1.70mm Pitch; 5 Pin, 14.35mm L X 8.64mm W X 4.65mm H body IPC Medium Density; Manufacturer Part Number: LM2596S-5.0; Pin Count: 6; Case: TO-263-5; Mounted: Yes; Socket: No; SMD: Yes; Sense: No; ComponentHeight: 4.65mm; HelpURL: \\cern.ch\dfs\Applications\Altium\Datasheets\LM2596S-5.0-NOPB.pdf; Author: CERN DEM JLC; CreateDate: 12/19/2018; LatestRevisionDate: 6/1/2022
J1 = DC Power Jack: DC Power Jack. Center Pin 2.5mm. Diameter: 5.7mm; Designer: Ali Hafizi; Company: Personal; Project Name: Laser; Adding Date: 10/21/2009
j2 j3 = Cooler Conector: 0.5mm pins
K1-K4 = Switch_11_11
K5-K9 = Relay: SPDT Relay; Designer: Eng. Saeid Jorablo; Company: E.P.I.L; Design_Date: 2011/10/31
L1 = IND_33UH_20%_PANASONIC_ELL6RH330M: Inductor With Magnetic core 1Dot; Part Description: SMD Choke Coil; Power: 600mA; Resistance: 0.38R; Tolerance: ±20%; Part Number: IND_33UH_20%_PANASONIC_ELL6RH330M; Component Kind: Standard; Component Type: Standard; Pin Count: 2; Value: 33uH; Manufacturer: PANASONIC; Manufacturer Part Number: ELL6RH330M; Mounted: Yes; Socket: No; SMD: Yes; Sense: No; ComponentHeight: 2.8mm; HelpURL: \\cern.ch\dfs\Applications\Altium\Datasheets\IND_PANASONIC_ELL6RH.pdf; Author: CERN DEM JMW; CreateDate: 1/9/2009; LatestRevisionDate: 1/9/2009
M1-M5 = Board Screw 3mm: Board Screw With Spacer 3mm; Designer: Abbas Basereh; Data: 16-12-2016; Link: *; Part. No: *
MOC1 = MOC3021-3: Opto-Triac; Designer: Seyed Mohsen Ghasemian; E-mail: picpars@gmail.com; Published: 17-11-2011; LatestRevisionDate: 17-11-2011; Publisher: www.picpars.com; WEB: www.picpars.com
Mos1 = IRFZ44: N-Channel 55V 51A _Tc_ 80W _Tc_ Through Hole TO-220AB; MF: Infineon Technologies; Value: *; Price: None; Package: TO-220 Infineon Technologies; SnapEDA_Link: https://www.snapeda.com/parts/IRFZ44/Infineon%20Technologies/view-part/568085/?ref=snap; Availability: Unavailable; MP: IRFZ44
NRF1 = NRF24L01P: RF Module; Ali Hafizi: Creature
P1-P3 = Header 5: Header, 5-Pin; LatestRevisionDate: 17-Jul-2002; LatestRevisionNote: Re-released for DXP Platform.; Publisher: Altium Limited
POT1 POT2 = POT: Variable Resistor; Value: 10K
Q1#1 = AO3400-5.8A: N-Channel 30 V 5.8A (Ta) 1.5W (Ta) Surface Mount SOT-23; MF: MDD; Check_prices: https://www.snapeda.com/parts/AO3400-5.8A/MDD/view-part/?ref=eda; Value: *; Availability: In Stock; MP: AO3400-5.8A; Price: None; Package: None; SnapEDA_Link: https://www.snapeda.com/parts/AO3400-5.8A/MDD/view-part/?ref=snap; Purchase-URL: https://pricing.snapeda.com/search/part/AO3400-5.8A/?ref=eda
Q2 = IRLML6402TRPBF: P-Channel 20 V 3.7A (Ta) 1.3W (Ta) Surface Mount Micro3Ã¢â€žÂ¢ /SOT-23; MF: Infineon; SnapEDA_Link: https://www.snapeda.com/parts/IRLML6402TRPBF/Infineon/view-part/?ref=snap; Package: SOT-23-3 ON Semiconductor; Value: *; MP: IRLML6402TRPBF; Check_prices: https://www.snapeda.com/parts/IRLML6402TRPBF/Infineon/view-part/?ref=eda
R1 = RES Array: Resistor Pack
R2-R4 = RES Axial 0.25W: Designer: Abbas Basereh; Desc.: RES Axial 0.25W; Data: 4-1-2017
R5 R6 R9-R12 = R0603_100K_0.1%_0.063W_10PPM: Resistor - 0.1%; Part Description: Thin Film Chip Resistor; Manufacturer: GENERIC; Manufacturer1 Part Number: RN73C1J100KBTDF; Value: 100k; Power: 0.063W; TC: ±10ppm; PressFit: No; Part Number: R0603_100K_0.1%_0.063W_10PPM; Component Kind: Standard; Component Type: Standard; Pin Count: 2; Status: Not Recommended; Manufacturer Part Number: R0603_100K_0.1%_0.063W_10PPM; Case: 0603; Mounted: Yes; Sense: No; Socket: No; SMD: Yes; Manufacturer1 Example: TYCO HOLSWORTHY; Manufacturer1 ComponentHeight: 0.55mm; HelpURL: \\cern.ch\dfs\Applications\Altium\Datasheets\R0603_Tyco_RN73.pdf; Author: CERN DEM JLC; CreateDate: 12/3/2007; LatestRevisionDate: 3/13/2008
R7 R8 R13-R23 R25 R27 R29 R31 R33 R34 R37 R38 R40 R42 R44 = RES 0805 0.125W: RES 0805; Designer: Abbas Basereh; Desc.: RES SMD 0805; Data: 16-12-2016
R24 R26 R28 R30 R32 R35 R36 R39 R41 R43 = RES 1206 0.25W: RES 1206; Designer: Abbas Basereh; Desc.: RES SMD 1206; Data: 16-12-2016
RL1 RL2 = REL_FINDER_40.61.9.009.0000: 16A SPDT PCB Relay, 40.61 Serie; Part Description: 16A, SPDT PCB Relay, 40 Series; Manufacturer: FINDER; PressFit: No; Sense Comment: Non-washable; Status Comment: Sensitive (See Sensitive Field); Value: 9VDC; Part Number: REL_FINDER_40.61.9.009.0000; Component Kind: Standard; Component Type: Standard; Pin Count: 8; PackageDescription: 8 Leads, 1 Pole 16A Relay, FINDER 40.61 Serie, Body 29mm x 12.4mm; Mounted: Yes; Socket: No; SMD: No; Sense: Yes; Status: Not Recommended; Manufacturer Part Number: 40.61.9.009.0000; ComponentHeight: 25mm; HelpURL: \\cern.ch\dfs\Applications\Altium\Datasheets\REL_FINDER_40.61.pdf; Author: CERN DEM JLC; CreateDate: 8/6/2012; LatestRevisionDate: 8/30/2018
Sp1 = MOLEX_22-04-1021: Connector 2 Male; Part Description: 2.5mm (.100") Pitch KK® Wire-to-Board Header, Vertical, with Friction Lock, 2 Circuits, Tin (Sn) Plating; Manufacturer: MOLEX; PressFit: No; Part Number: MOLEX_22-04-1021; Component Kind: Standard; Component Type: Standard; Pin Count: 2; Family: KK®; Mounted: Yes; Socket: No; SMD: No; Sense: No; Status: Obsolete; Manufacturer Part Number: 22-04-1021; ComponentHeight: 11.7mm; HelpURL: \\cern.ch\dfs\Applications\Altium\Datasheets\MOLEX_22-04-1021.pdf; Author: CERN DEM JLC; CreateDate: 2/9/2012; LatestRevisionDate: 2/9/2012
T1-T5 = DG35-5pin: DG35C_Contacts pitch    8.25 mm
U1 U2 = 6N137: HIGH SPEED-10 MBit/s  LOGIC GATE OPTOCOUPLERS; Designer: Saeid Jorablo; Company: ControTEK; Adding Date: 1387/01/08
U3 = STM32G431RBT6: ARMÂ® CortexÂ®-M4F STM32G4 Microcontroller IC 32-Bit Single-Core 170MHz 128KB (128K x 8) FLASH 64-LQFP (10x10); MF: STMicroelectronics; SnapEDA_Link: https://www.snapeda.com/parts/STM32G431RBT6/STMicroelectronics/view-part/?ref=snap; Package: LQFP-64 STMicroelectronics; Value: *; MP: STM32G431RBT6; Check_prices: https://www.snapeda.com/parts/STM32G431RBT6/STMicroelectronics/view-part/?ref=eda
U4 U6 = ISO7221AD: CA-IS3722 High-Speed Dual-Channel Digital Isolators; MF: Texas Instruments; SnapEDA_Link: https://www.snapeda.com/parts/ISO7221AD/Texas+Instruments/view-part/?ref=snap; Package: SOIC-8 Texas Instruments; Value: *; MP: ISO7221AD; Check_prices: https://www.snapeda.com/parts/ISO7221AD/Texas+Instruments/view-part/?ref=eda
U5 = W25Q64BVSSIG: FLASH - NOR Memory IC 64Mb (8M x 8) SPI 80 MHz 8-SOIC; MF: Winbond Electronics; SnapEDA_Link: https://www.snapeda.com/parts/W25Q64BVSSIG/Winbond/view-part/?ref=snap; Package: SOIC-8 Winbond; Value: *; MP: W25Q64BVSSIG; Check_prices: https://www.snapeda.com/parts/W25Q64BVSSIG/Winbond/view-part/?ref=eda
U7 = PAM8403: Audio Amp Speaker 2-CH Stereo 3.2W Class-D 16-Pin SOP T/R; MF: Diodes Zetex; SnapEDA_Link: https://www.snapeda.com/parts/PAM8403/Diodes+Inc./view-part/?ref=snap; Package: None; Value: *; MP: PAM8403; Check_prices: https://www.snapeda.com/parts/PAM8403/Diodes+Inc./view-part/?ref=eda
U8 = ULN2003A: SEVEN DARLINGTON ARRAYS; Published: 2017-3-2; DatasheetVersion: STMicroelectronics GROUP OF COMPANIES; PackageVersion: 2017-3-2; PackageReference: SO16_N; Publisher: Abbas Basereh; PackageDescription: 16-Pin Small Outline Integrated Circuit 1.27 mm Pitch, IPC High Density; Supplier 1: Digi-Key; Supplier Part Number 1: ULN2003A; Supplier 2: Mouser; Supplier Part Number 2: ULN2003A; ComponentLink1Description: Datasheet; ComponentLink2URL: http://www.st.com
U9 = ESP32-WROOM-32D-N4: Bluetooth, WiFi 802.11b/g/n, Bluetooth v4.2 +EDR, Class 1, 2 and 3 Transceiver Module 2.4GHz ~ 2.5GHz Integrated, Trace Surface Mount; MF: Espressif Systems; SnapEDA_Link: https://www.snapeda.com/parts/ESP32-WROOM-32D-N4/Espressif+Systems/view-part/?ref=snap; Package: Non Standard Espressif Systems; Value: *; MP: ESP32-WROOM-32D-N4; Check_prices: https://www.snapeda.com/parts/ESP32-WROOM-32D-N4/Espressif+Systems/view-part/?ref=eda
UP1 UP2 = AMS1117-x.x: x.x Volt, 800mA Low-Dropout Linear Regulator, 4-pin SOT-223; Designer: Ali Hafizi; Data: 16-12-2016
Y1 = XTAL: XTAL Crystal; Designer: ABBAS BASEREH; Value: 12 MHz; Design Date: 2017-1-3; ComponentLink1Description: Datasheet; ComponentLink2Description: Reference; Mounting Technology: Surface Mount\Through-Hole; Status: Unreleased
Y2 = Crystal-ABS09-32.768KHZ-T: 32.768 kHz Â±20ppm Crystal 12.5pF 70 kOhms 2-SMD, No Lead; MF: Abracon LLC; Purchase-URL: https://pricing.snapeda.com/search/part/ABS09-32.768KHZ-T/?ref=eda; SnapEDA_Link: https://www.snapeda.com/parts/ABS09-32.768KHZ-T/Abracon+LLC/view-part/?ref=snap; Value: *; MP: ABS09-32.768KHZ-T; Package: SMD-2 Abracon LLC; Availability: In Stock; Price: None; Check_prices: https://www.snapeda.com/parts/ABS09-32.768KHZ-T/Abracon+LLC/view-part/?ref=eda

## Sheet Sch_Z35_Wireless_board.SchDoc
size C; SheetNumber: 2; SheetTotal: 3
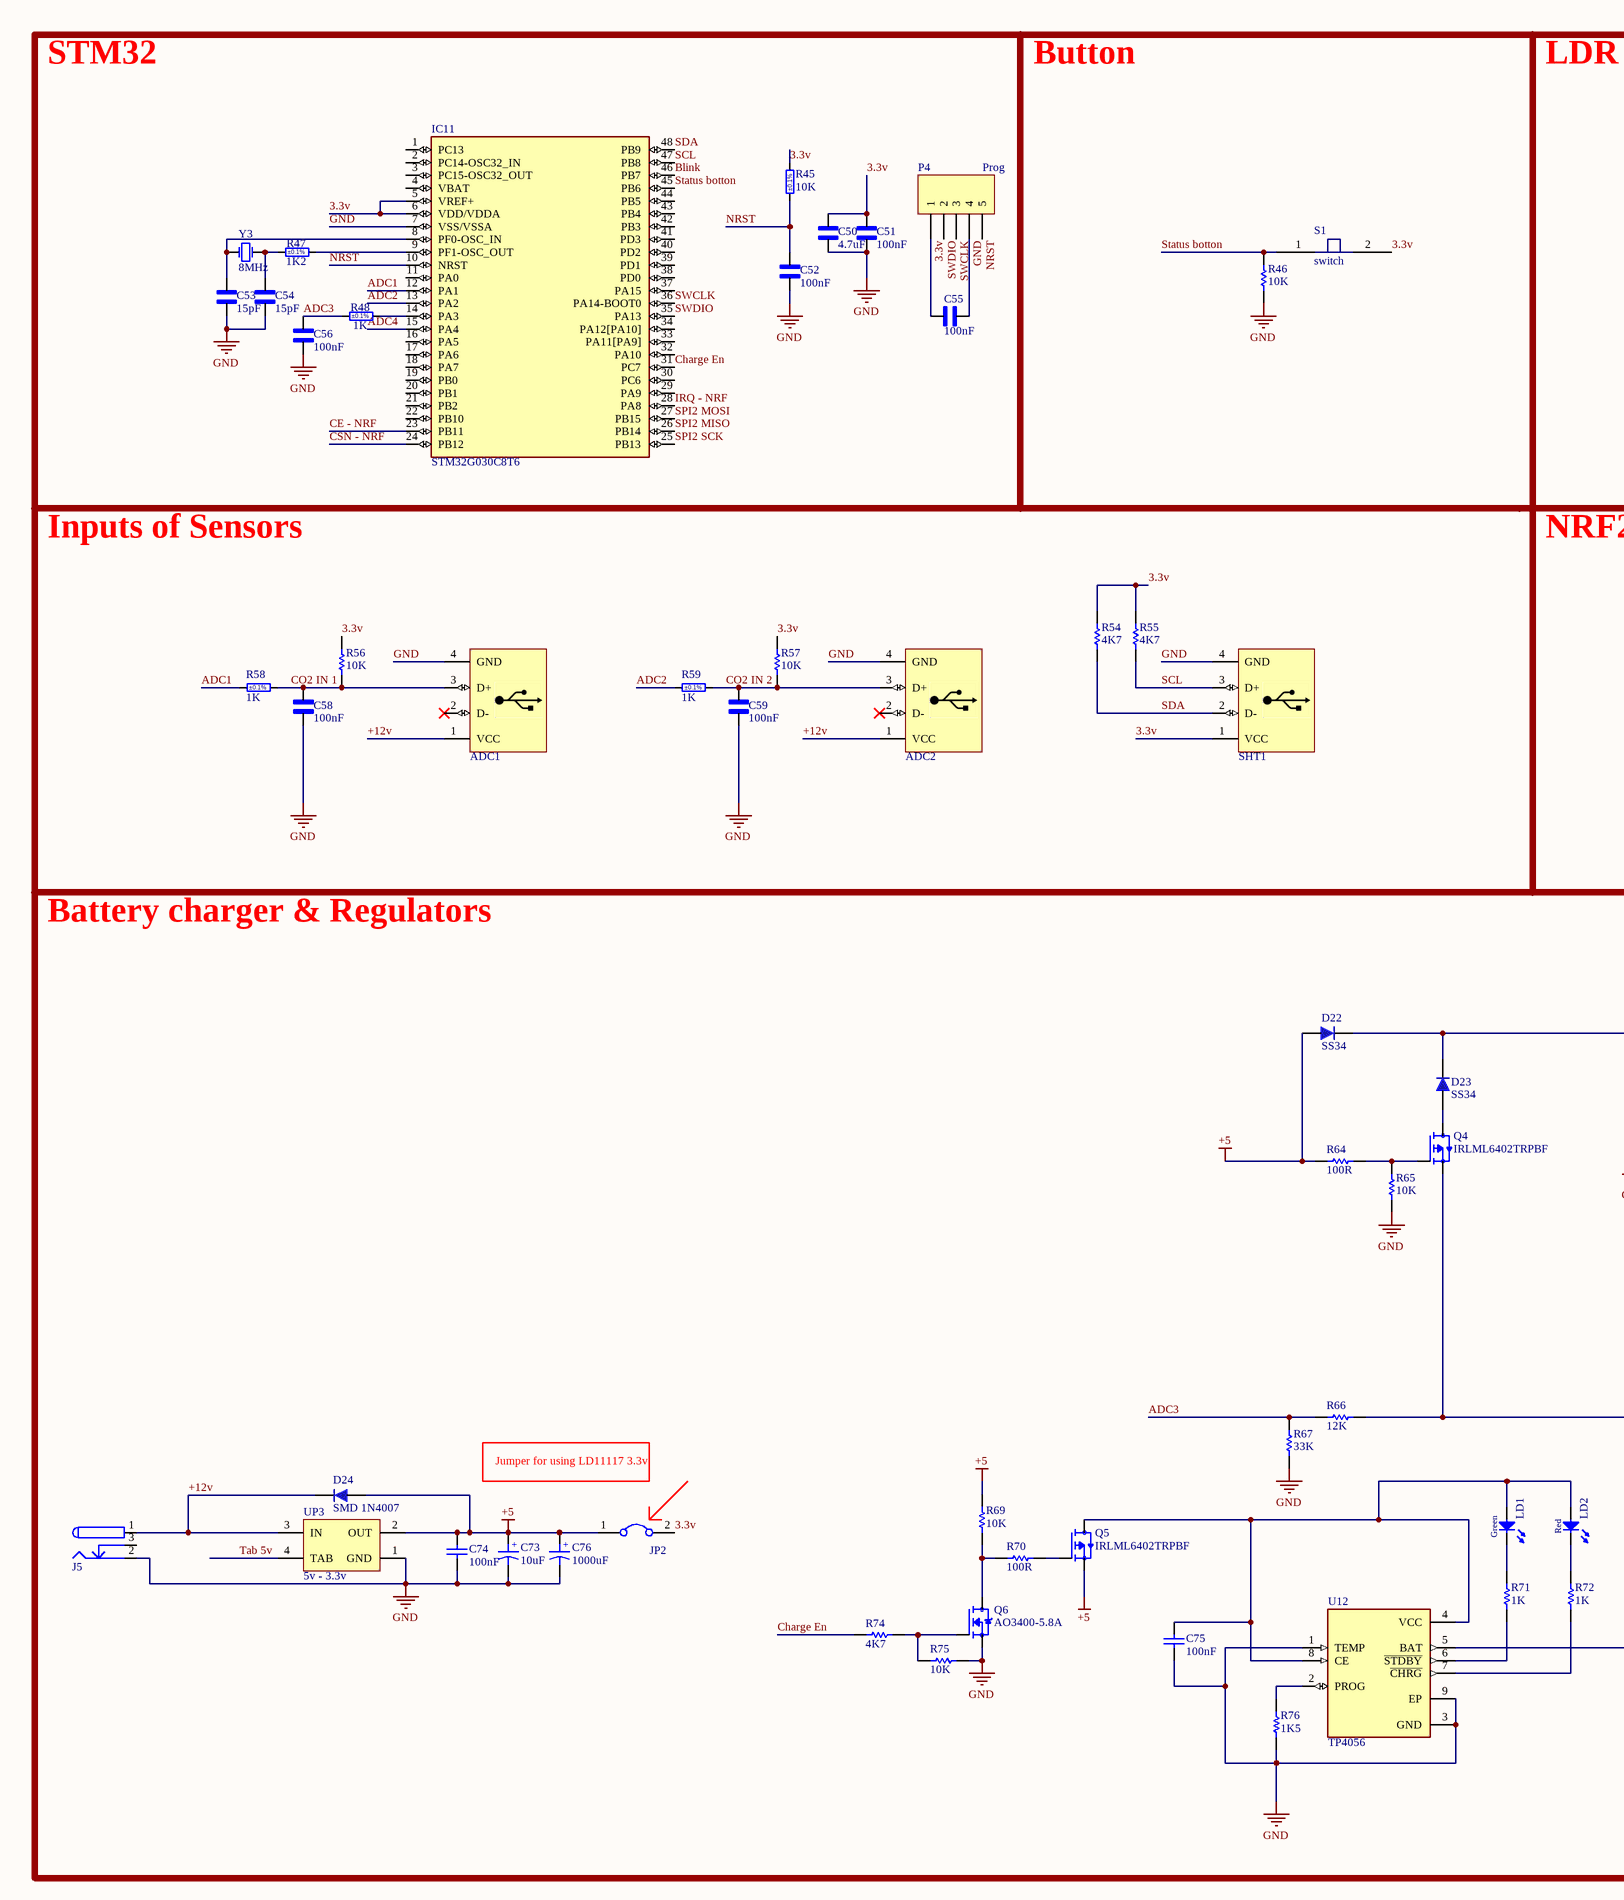
[diagram p6: Sch_Z35_Wireless_board.SchDoc, left]
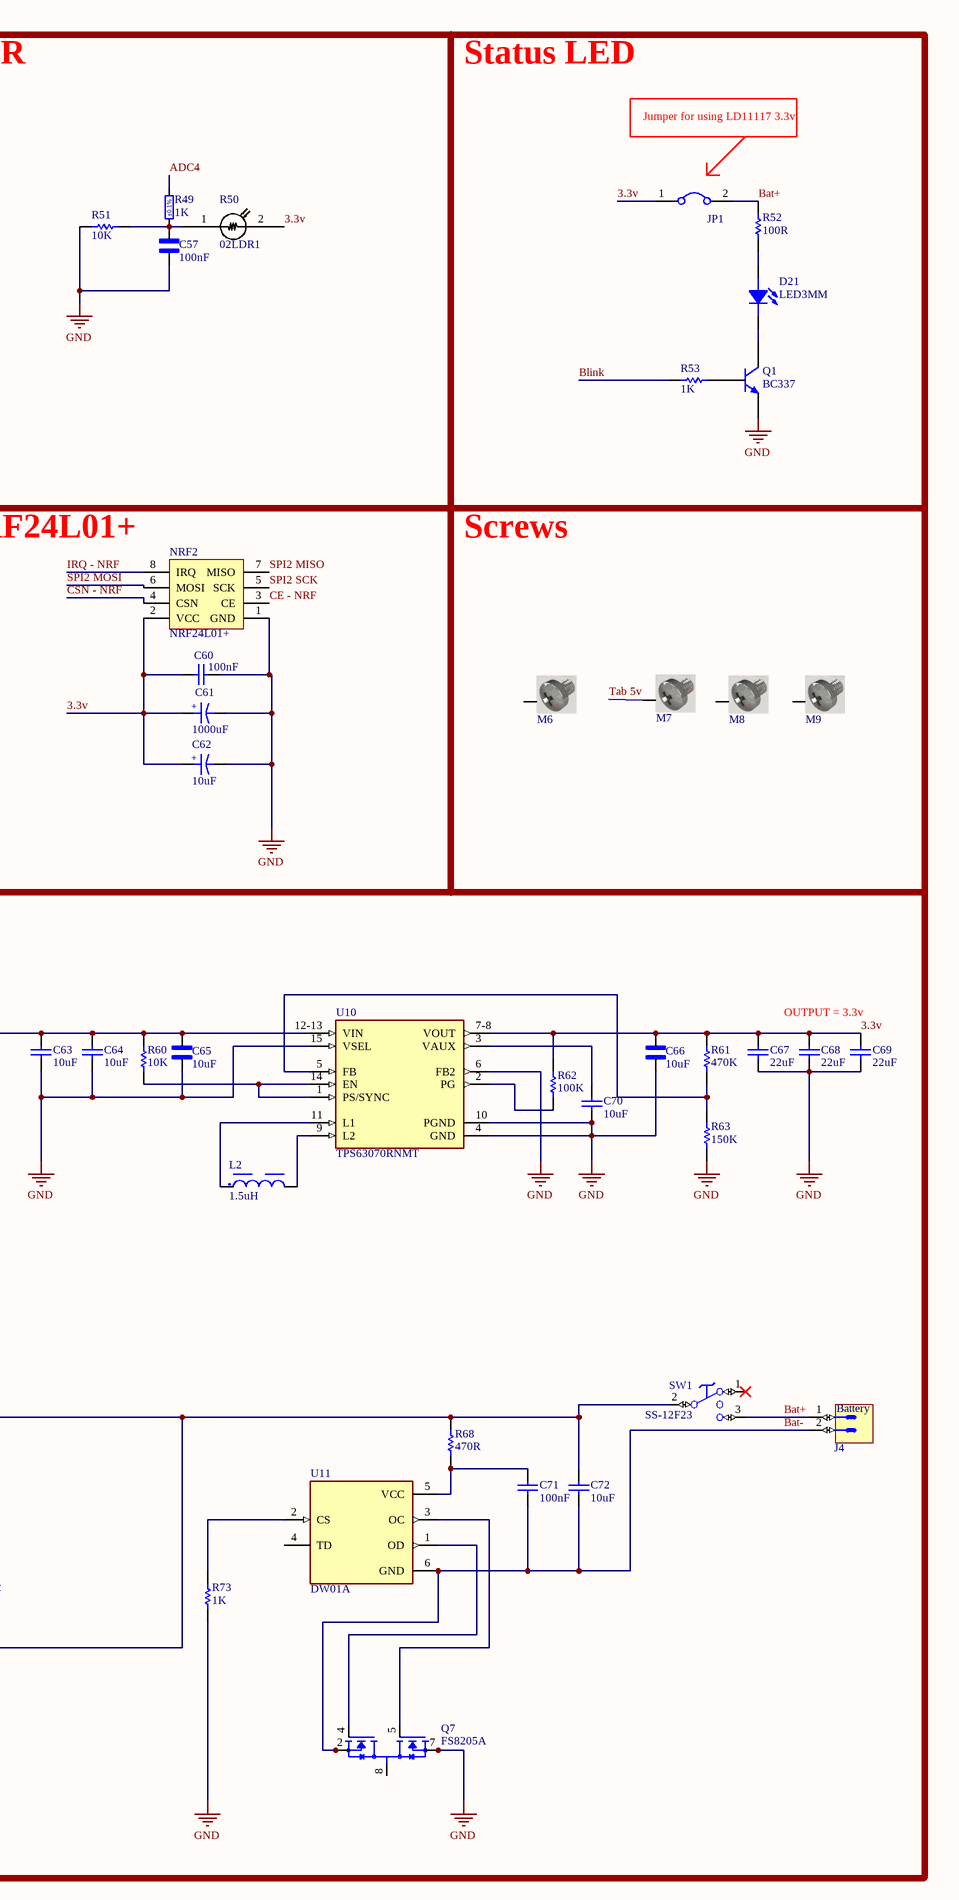
[diagram p7: Sch_Z35_Wireless_board.SchDoc, right]

### Parts
(Parts that share a designator on the sheet are numbered #1, #2 ... from top to bottom, then left to right.)
ADC1  USB Connector  [USB2.5-2H4C]  (value not drawn)
ADC2  USB Connector  [USB2.5-2H4C]  (value not drawn)
C50  4.7uF  [CAPC1608X90]
C51  100nF  [CAPC1608X90]
C52  100nF  [CAPC1608X90]
C53  15pF  [CAPC1608X90]
C54  15pF  [CAPC1608X90]
C55  100nF  [CAPC1608X90]
C56  100nF  [CAPC1608X90]
C57  100nF  [CAPC1608X90]
C58  100nF  [CAPC1608X90]
C59  100nF  [CAPC1608X90]
C60  100nF  [CAPC3413X12N]
C61  1000uF  [Cap electrolitic radial 8x14-3.5]
C62  10uF  [Cap electrolitic radial 6.3x12-2.5]
C63  10uF  [CAPC3413X12N]
C64  10uF  [CAPC3413X12N]
C65  10uF  [CAPC1608X90]
C66  10uF  [CAPC1608X90]
C67  22uF  [CAPC3413X12N]
C68  22uF  [CAPC3413X12N]
C69  22uF  [CAPC3413X12N]
C70  10uF  [CAPC3413X12N]
C71  100nF  [CAPC3413X12N]
C72  10uF  [CAPC3413X12N]
C73  10uF  [Cap electrolitic radial 6.3x12-2.5]
C74  100nF  [CAPC3413X12N]
C75  100nF  [CAPC3413X12N]
C76  1000uF  [Cap electrolitic radial 8x14-3.5]
D21  LED3MM  [LED3mm_GRN]
D22  SS34  [DIODE SMD]
D23  SS34  [DIODE SMD]
D24  SMD 1N4007  [DIODE SMD]
IC11  STM32G030C8T6  [QFP50P900X900X160-48N]
J4  Battery  [MOLEX_22-04-1021]
J5  DC Power Jack  [DC Power Jack 1]  (value not drawn)
JP1  Jumper  [Jumper Small - 2.54 - GRAY]  (value not drawn)
JP2  Jumper  [Jumper Small - 2.54 - GRAY]  (value not drawn)
L2  1.5uH  [WE-LHMI_7030]
LD1  Green  [LED_3MM_GREEN_1C-2A]
LD2  Red  [LED_3MM_RED_1C-2A]
M6  Screw3mm  [Board Screw 3mm]  (value not drawn)
M7  Screw3mm  [Board Screw 3mm]  (value not drawn)
M8  Screw3mm  [Board Screw 3mm]  (value not drawn)
M9  Screw3mm  [Board Screw 3mm]  (value not drawn)
NRF2  NRF24L01+  [NRF24L01P]
P4  Prog  [HDR1X5]
Q1#2  BC337  [SOT23_M]
Q4  IRLML6402TRPBF  [SOT95P237X112-3N]
Q5  IRLML6402TRPBF  [SOT95P237X112-3N]
Q6  AO3400-5.8A  [SOT95P260X140-3N]
Q7  FS8205A  [SOP65P640X120-8N]
R45  10K  Tolerance: ±0.1%  [RESC1608X55N]
R46  10K  [RESC3413X04N]
R47  1K2  Tolerance: ±0.1%  [RESC1608X55N]
R48  1K  Tolerance: ±0.1%  [RESC1608X55N]
R49  1K  Tolerance: ±0.1%  [RESC1608X55N]
R50  02LDR1  [LDR1_NTE]
R51  10K  [RESC3413X04N]
R52  100R  [RESC3413X04N]
R53  1K  [RESC3413X04N]
R54  4K7  [RESC3413X04N]
R55  4K7  [RESC3413X04N]
R56  10K  [RESC3413X04N]
R57  10K  [RESC3413X04N]
R58  1K  Tolerance: ±0.1%  [RESC1608X55N]
R59  1K  Tolerance: ±0.1%  [RESC1608X55N]
R60  10K  [RESC3413X04N]
R61  470K  [RESC3413X04N]
R62  100K  [RESC3413X04N]
R63  150K  [RESC3413X04N]
R64  100R  [RESC3413X04N]
R65  10K  [RESC3413X04N]
R66  12K  [RESC3413X04N]
R67  33K  [RESC3413X04N]
R68  470R  [RESC3413X04N]
R69  10K  [RESC3413X04N]
R70  100R  [RESC3413X04N]
R71  1K  [RESC3413X04N]
R72  1K  [RESC3413X04N]
R73  1K  [RESC3413X04N]
R74  4K7  [RESC3413X04N]
R75  10K  [RESC3413X04N]
R76  1K5  [RESC3413X04N]
S1  switch  [PCBComponent_1]
SHT1  USB Connector  [USB2.5-2H4C]  (value not drawn)
SW1  SS-12F23  [SW_C&K_110xM2S3AxE2]
U10  TPS63070RNMT  [QFN50P250X300X100-15N]
U11  DW01A  [SOT95P280X145-6N]
U12  TP4056  [SOP127P600X175-9N]
UP3  5v - 3.3v  [SOT223]
Y3  8MHz  [CRYSTAL Small]

### Blocks framed on the sheet
STM32: C50-C56 IC11 P4 R45 R47 R48 Y3

### Nets
3.3v: C50.1 C51.1 C55.1 C60.2 C61.1 C62.1 C66.1 C67.1 C68.1 C69.1 IC11.5(VREF+) IC11.6(VDD/VDDA) JP1.1 JP2.2 NRF2.2(VCC) P4.1 R45.2 R50.2 R54.1 R55.1 R56.1 R57.1 R61.2 R62.2 S1.2 SHT1.1(VCC) U10.7-8(VOUT)
+5: C73.1 C74.1 C76.1 D22.1 D24.1 JP2.1 Q5.2(S) R64.2 R69.2 UP3.2(OUT)
GND: ADC1.4(GND) ADC2.4(GND) C50.2 C51.2 C52.2 C53.2 C54.2 C55.2 C56.2 C57.2 C58.2 C59.2 C60.1 C61.2 C62.2 C63.2 C64.2 C65.2 C66.2 C67.2 C68.2 C69.2 C70.2 C73.2 C74.2 C75.2 C76.2 IC11.7(VSS/VSSA) J5.2 NRF2.1(GND) P4.4 Q1#2.2(E) Q6.2(S) Q7.6(S2) Q7.7(S2) R46.1 R51.1 R63.1 R65.2 R67.2 R73.1 R75.2 R76.2 SHT1.4(GND) U10.4(GND) U10.6(FB2) U10.10(PGND) U10.15(VSEL) U12.1(TEMP) U12.3(GND) U12.9(EP) UP3.1(GND)
+12v: ADC1.1(VCC) ADC2.1(VCC) D24.2 J5.1 UP3.3(IN)
ADC1: IC11.12(PA1) R58.2
ADC2: IC11.13(PA2) R59.2
ADC3: C56.1 R48.1 R66.2 R67.1
ADC4: IC11.15(PA4) R49.2
Bat+: J4.1 JP1.2 R52.2 SW1.3(NO)
Bat-: C71.2 C72.2 J4.2 Q7.2(S1) Q7.3(S1) U11.6(GND)
Blink: IC11.46(PB7) R53.2
CE - NRF: IC11.23(PB11) NRF2.3(CE)
Charge En: IC11.31(PC7) R74.1
CO2 IN 1: ADC1.3(D+) C58.1 R56.2 R58.1
CO2 IN 2: ADC2.3(D+) C59.1 R57.2 R59.1
CSN - NRF: IC11.24(PB12) NRF2.4(CSN)
IRQ - NRF: IC11.28(PA8) NRF2.8(IRQ)
NRST: C52.1 IC11.10(NRST) P4.5 R45.1
SCL: IC11.47(PB8) R55.2 SHT1.3(D+)
SDA: IC11.48(PB9) R54.2 SHT1.2(D-)
SPI2 MISO: IC11.26(PB14) NRF2.7(MISO)
SPI2 MOSI: IC11.27(PB15) NRF2.6(MOSI)
SPI2 SCK: IC11.25(PB13) NRF2.5(SCK)
Status botton: IC11.45(PB6) R46.2 S1.1
SWCLK: IC11.36(PA14-BOOT0) P4.3
SWDIO: IC11.35(PA13) P4.2
Tab 5v: M7.S UP3.4(TAB)
NetC53_1: C53.1 IC11.8(PF0-OSC_IN) Y3.1(OSC1)
NetC54_1: C54.1 R47.1 Y3.2(OSC2)
NetC57_1: C57.1 R49.1 R50.1 R51.2
NetC63_1: C63.1 C64.1 C65.1 D22.2 D23.2 R60.2 U10.12-13(VIN)
NetC70_1: C70.1 U10.3(VAUX)
NetC71_1: C71.1 R68.2 U11.5(VCC)
NetC72_1: C72.1 Q4.2(S) R66.1 R68.1 SW1.2(C) U12.5(BAT)
NetC75_1: C75.1 LD1.2(A) LD2.2(A) Q5.3(D) U12.4(VCC) U12.8(CE)
NetD21_1: D21.1(ANODE) R52.1
NetD21_2: D21.2(CATHODE) Q1#2.3(C)
NetD23_1: D23.1 Q4.3(D)
NetIC11_9: IC11.9(PF1-OSC_OUT) R47.2
NetIC11_14: IC11.14(PA3) R48.2
NetL2_1: L2.1 U10.11(L1)
NetL2_2: L2.2 U10.9(L2)
NetLD1_1: LD1.1(C) R71.2
NetLD2_1: LD2.1(C) R72.2
NetQ1#2_1: Q1#2.1(B) R53.1
NetQ4_1: Q4.1(G) R64.1 R65.1
NetQ5_1: Q5.1(G) R70.2
NetQ6_1: Q6.1(G) R74.2 R75.1
NetQ6_3: Q6.3(D) R69.1 R70.1
NetQ7_1: Q7.1(D12) Q7.8(D12)
NetQ7_4: Q7.4(G1) U11.1(OD)
NetQ7_5: Q7.5(G2) U11.3(OC)
NetR60_1: R60.1 U10.1(PS/SYNC) U10.14(EN)
NetR61_1: R61.1 R63.2 U10.5(FB)
NetR62_1: R62.1 U10.2(PG)
NetR71_1: R71.1 U12.6(~{STDBY})
NetR72_1: R72.1 U12.7(~{CHRG})
NetR73_2: R73.2 U11.2(CS)
NetR76_1: R76.1 U12.2(PROG)

Not connected (* = marked no-connect by the designer): ADC1 2(D-)*; ADC2 2(D-)*; IC11 1(PC13) 2(PC14-OSC32_IN) 3(PC15-OSC32_OUT) 4(VBAT) 11(PA0) 16(PA5) 17(PA6) 18(PA7) 19(PB0) 20(PB1) 21(PB2) 22(PB10) 29(PA9) 30(PC6) 32(PA10) 33(PA11[PA9]) 34(PA12[PA10]) 37(PA15) 38(PD0) 39(PD1) 40(PD2) 41(PD3) 42(PB3) 43(PB4) 44(PB5); J5 3; M6 S; M8 S; M9 S; SW1 1(NC)*; U11 4(TD)

### Notes on the sheet
- Button
- LDR
- Status LED
- Jumper for using LD11117 3.3v
- Inputs of Sensors
- NRF24L01+
- Screws
- Battery charger & Regulators
- OUTPUT = 3.3v
- (in symbol Cap ELECTROLITIC TOTAL SIZE) +

### Library data of the parts
ADC1 ADC2 SHT1 = USB A-Type: USB Connector-A Type
C50-C59 C65 C66 = Cap 0603: as C14 on sheet Sch_Z35; SnapEDA_Link: https://www.snapeda.com/parts/C0603C104J3RACTU/KEMET/view-part/?ref=snap; Package: 603-2 KEMET; Value: *; MF: KEMET; MP: C0603C104J3RACTU; Check_prices: https://www.snapeda.com/parts/C0603C104J3RACTU/KEMET/view-part/?ref=eda
C60 C63 C64 C67-C72 C74 C75 = CAP SMD 0805: CAP 0805; Designer: Abbas Basereh; Desc.: CAP SMD 0805; Data: 16-12-2016
C61 C62 C73 C76 = Cap ELECTROLITIC TOTAL SIZE: as C1 on sheet Sch_Z35; Data: 16-12-2016; Part. No: *
D21 = LED 3MM: Light Emitting Diode; Designer: Ali Hafizi
D22-D24 = Diode SMD Package: Diode SMD Pakage
IC11 = STM32G030C8T6: ARMÂ® CortexÂ®-M0+ series Microcontroller IC 32-Bit Single-Core 64MHz 64KB (64K x 8) FLASH 48-LQFP (7x7); MF: STMicroelectronics; Check_prices: https://www.snapeda.com/parts/STM32G030C8T6/STMicroelectronics/view-part/?ref=eda; Purchase-URL: https://pricing.snapeda.com/search/part/STM32G030C8T6/?ref=eda; Price: None; Availability: In Stock; Package: LQFP-48 STMicroelectronics; SnapEDA_Link: https://www.snapeda.com/parts/STM32G030C8T6/STMicroelectronics/view-part/?ref=snap; Value: *; MP: STM32G030C8T6
J4 = MOLEX_22-04-1021: as Sp1 on sheet Sch_Z35; Part Number: MOLEX_22-04-1021; Component Kind: Standard; Component Type: Standard; Pin Count: 2; Family: KK®; Mounted: Yes; Socket: No; SMD: No; Sense: No; Status: Obsolete; Manufacturer Part Number: 22-04-1021; ComponentHeight: 11.7mm; HelpURL: \\cern.ch\dfs\Applications\Altium\Datasheets\MOLEX_22-04-1021.pdf; Author: CERN DEM JLC; CreateDate: 2/9/2012; LatestRevisionDate: 2/9/2012
J5 = DC Power Jack: as J1 on sheet Sch_Z35; Adding Date: 10/21/2009
JP1 JP2 = Jumper: Company: E.P.I.L; Defualt State: Close; Design Date: 2011/11/02
L2 = TMPC0603H-1R5MG-D: SMD Power Choke Coil 1.5uH 18A 7.3x6.6mm; MP: altium_native_batch; Package: None; Price: None; Value: *; Availability: Unavailable
LD1 = LED_AVAGO_HLMP-1790: LED Green 1C 2A; Part Description: 3mm Green LED; Manufacturer: AVAGO TECHNOLOGIES; PressFit: No; Bonding: No; Part Number: LED_AVAGO_HLMP-1790; Component Kind: Standard; Component Type: Standard; Color: Green; PackageDescription: LED, Green, Body Dia. 3.43 mm, Pin spacing 2.54mm; Manufacturer Part Number: HLMP-1790; Pin Count: 2; Mounted: Yes; Socket: No; SMD: No; Sense: No; ComponentHeight: 6.35mm(min); HelpURL: \\cern.ch\dfs\Applications\Altium\Datasheets\LED_AVAGO_HLMP-1790.pdf; Author: CERN DEM JLC; CreateDate: 6/12/2008; LatestRevisionDate: 3/17/2010
LD2 = LED_AVAGO_HLMP-1700: LED Red 1C 2A; Part Description: 3mm Red LED; Manufacturer: AVAGO TECHNOLOGIES; PressFit: No; Bonding: No; Part Number: LED_AVAGO_HLMP-1700; Component Kind: Standard; Component Type: Standard; Color: Red; PackageDescription: LED, Red, Body Dia. 3.43 mm, Pin spacing 2.54mm; Manufacturer Part Number: HLMP-1700; Pin Count: 2; Mounted: Yes; Socket: No; SMD: No; Sense: No; ComponentHeight: 6.35mm(min); HelpURL: \\cern.ch\dfs\Applications\Altium\Datasheets\LED_AVAGO_HLMP-1700.pdf; Author: CERN DEM JLC; CreateDate: 6/12/2008; LatestRevisionDate: 3/17/2010
M6-M9 = Board Screw 3mm: as M1 on sheet Sch_Z35; Data: 16-12-2016; Link: *; Part. No: *
NRF2 = NRF24L01P: RF Module; Ali Hafizi: Creature
P4 = Header 5: Header, 5-Pin; LatestRevisionDate: 17-Jul-2002; LatestRevisionNote: Re-released for DXP Platform.; Publisher: Altium Limited
Q1#2 = BC337: 45 V, 500 mA NPN general-purpose transistors; Published: 2017-2-8; LatestRevisionDate: 2017; LatestRevisionNote: IPC-7351 Footprint Added.; DatasheetVersion: 2017; PackageVersion: 2017-2-8; PackageReference: SOT23; Publisher: Abbas Basereh; PackageDescription: 3-Pin SOT-23 Package 0.95 mm Pitch, 2.3 mm Lead Span; ComponentLink1Description: Manufacturer Link; ComponentLink1URL: http://www.nxp.com/; ComponentLink2Description: Datasheet; ComponentLink2URL: http://www.nxp.com/
Q4 Q5 = IRLML6402TRPBF: as Q2 on sheet Sch_Z35; SnapEDA_Link: https://www.snapeda.com/parts/IRLML6402TRPBF/Infineon/view-part/?ref=snap; Package: SOT-23-3 ON Semiconductor; Value: *; MP: IRLML6402TRPBF; Check_prices: https://www.snapeda.com/parts/IRLML6402TRPBF/Infineon/view-part/?ref=eda
Q6 = AO3400-5.8A: as Q1#1 on sheet Sch_Z35; Check_prices: https://www.snapeda.com/parts/AO3400-5.8A/MDD/view-part/?ref=eda; Value: *; Availability: In Stock; MP: AO3400-5.8A; Price: None; Package: None; SnapEDA_Link: https://www.snapeda.com/parts/AO3400-5.8A/MDD/view-part/?ref=snap; Purchase-URL: https://pricing.snapeda.com/search/part/AO3400-5.8A/?ref=eda
Q7 = FS8205A: Dual N-Channel Enhancement Mode Power MOSFET; MF: Fortune Semiconductor; SnapEDA_Link: https://www.snapeda.com/parts/FS8205A/Fortune+Semiconductor/view-part/?ref=snap; Package: Package; Value: *; MP: FS8205A; Check_prices: https://www.snapeda.com/parts/FS8205A/Fortune+Semiconductor/view-part/?ref=eda
R45 R47-R49 R58 R59 = R0603_100K_0.1%_0.063W_10PPM: as R5 on sheet Sch_Z35; Part Number: R0603_100K_0.1%_0.063W_10PPM; Component Kind: Standard; Component Type: Standard; Pin Count: 2; Status: Not Recommended; Manufacturer Part Number: R0603_100K_0.1%_0.063W_10PPM; Case: 0603; Mounted: Yes; Sense: No; Socket: No; SMD: Yes; Manufacturer1 Example: TYCO HOLSWORTHY; Manufacturer1 ComponentHeight: 0.55mm; HelpURL: \\cern.ch\dfs\Applications\Altium\Datasheets\R0603_Tyco_RN73.pdf; Author: CERN DEM JLC; CreateDate: 12/3/2007; LatestRevisionDate: 3/13/2008
R46 R51-R57 R60-R76 = RES 0805 0.125W: as R7 on sheet Sch_Z35; Data: 16-12-2016
R50 = LDR 12mm: 12mm LDR / PIN to PIN is 9mm; Manufacturer_Name: NTE Electronics; Copyright: Copyright (C) 2025 Ultra Librarian. All rights reserved.; Manufacturer_Part_Number: 02LDR1; RefDes: RefDes; Type: Type
S1 = stand_key
SW1 = SW_C&K_1103M2S3AQE2: SPDT Switch; Part Description: Right Angled PC Thru-Hole SPDT Slide Switch, .200" High Actuator, C&K 1000 Series; Manufacturer: C&K; PressFit: No; Sense Comment: Non-washable; Part Number: SW_C&K_1103M2S3AQE2; Component Kind: Standard; Component Type: Standard; Pin Count: 5; PackageDescription: Right Angle, PC Thru-Hole SPDT Slide Switch, .200" High Actuator, C&K 1000 Series; Family: Switch; Mounted: Yes; Socket: No; SMD: No; Sense: Yes; Status: None; Manufacturer Part Number: 1103M2S3AQE2; ComponentHeight: 6.6mm; HelpURL: \\cern.ch\dfs\Applications\Altium\Datasheets\SW_C&K_1103M2S3AQE2.pdf; Author: CERN DEM BC; CreateDate: 7/1/2019; LatestRevisionDate: 7/1/2019
U10 = TPS63070RNMT: TPS63070 2-V to 16-V Buck-Boost Converter With 3.6-A Switch Current; MF: Texas Instruments; SnapEDA_Link: https://www.snapeda.com/parts/TPS63070RNMT/Texas+Instruments/view-part/?ref=snap; Package: VQFN-HR-15 Texas Instruments; Value: *; MP: TPS63070RNMT; Check_prices: https://www.snapeda.com/parts/TPS63070RNMT/Texas+Instruments/view-part/?ref=eda
U11 = DW01A: One Cell Lithium-ion/Polymer Battery Protection IC; MF: Fortune Semiconductor; SnapEDA_Link: https://www.snapeda.com/parts/DW01A/Fortune+Semiconductor/view-part/?ref=snap; Package: SOT-23-6 Fortune Semiconductor; Value: *; MP: DW01A; Check_prices: https://www.snapeda.com/parts/DW01A/Fortune+Semiconductor/view-part/?ref=eda
U12 = TP4056: Complete single cell Li-Ion battery with a constant current / constant voltage linear charger; MF: NanJing Top Power ASIC Corp.; Check_prices: https://www.snapeda.com/parts/TP4056/NanJing+Top+Power+ASIC+Corp./view-part/?ref=eda; SnapEDA_Link: https://www.snapeda.com/parts/TP4056/NanJing+Top+Power+ASIC+Corp./view-part/?ref=snap; Price: None; Availability: Not in stock; Package: Package; MP: TP4056; Value: *
UP3 = AMS1117-x.x: as UP1 on sheet Sch_Z35; Data: 16-12-2016
Y3 = XTAL: as Y1 on sheet Sch_Z35; Design Date: 2017-1-3; ComponentLink1Description: Datasheet; ComponentLink2Description: Reference; Mounting Technology: Surface Mount\Through-Hole; Status: Unreleased

## Sheet Sch_Z35_Sensors.SchDoc
size A; SheetNumber: 3; SheetTotal: 3
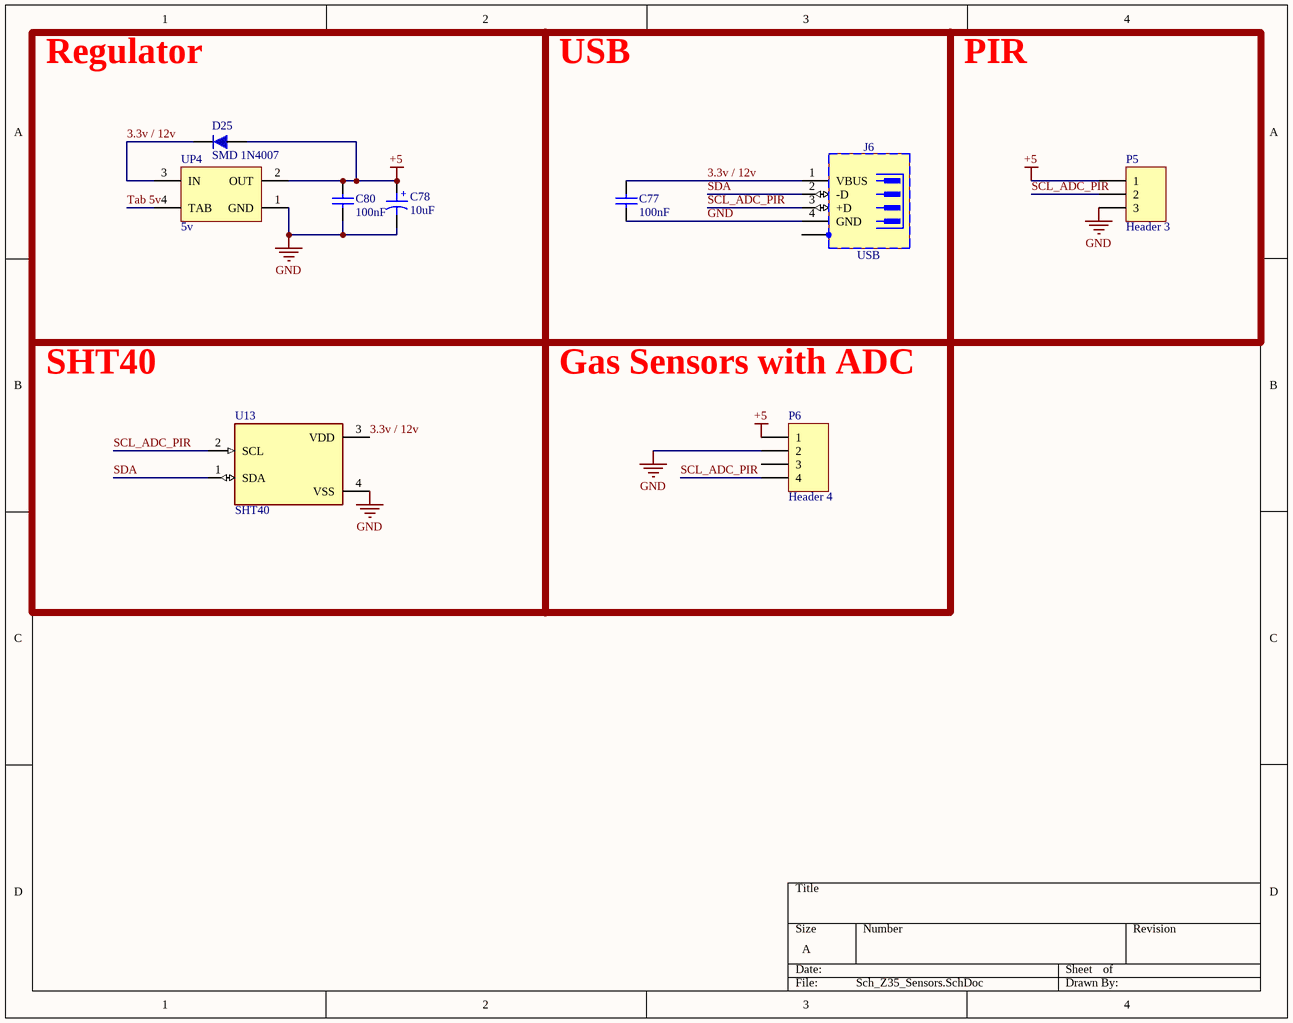
[diagram p8: Sch_Z35_Sensors.SchDoc]

### Parts
C77  100nF  [CAPC3413X12N]
C78  10uF  [Cap electrolitic radial 6.3x12-2.5]
C80  100nF  [CAPC3413X12N]
D25  SMD 1N4007  [DIODE SMD]
J6  USB  [MOLEX_48037-0001]
P5  Header 3  [HDR1X3]
P6  Header 4  [HDR1X4]
U13  SHT40  [SHT4X]
UP4  5v  [SOT223]

### Blocks framed on the sheet
Regulator: C78 C80 D25 UP4

### Nets
+5: C78.1 C80.1 D25.1 P5.1 P6.1 UP4.2(OUT)
GND: C77.2 C78.2 C80.2 J6.4(GND) P5.3 P6.2 U13.4(VSS) UP4.1(GND)
3.3v / 12v: C77.1 D25.2 J6.1(VBUS) U13.3(VDD) UP4.3(IN)
SCL_ADC_PIR: J6.3(+D) P5.2 P6.4 U13.2(SCL)
SDA: J6.2(-D) U13.1(SDA)
Tab 5v: UP4.4(TAB)

Not connected (* = marked no-connect by the designer): J6 5(SHIELD); P6 3

### Notes on the sheet
- USB
- PIR
- SHT40
- Gas Sensors with ADC
- (in symbol Cap ELECTROLITIC TOTAL SIZE) +

### Library data of the parts
C77 C80 = CAP SMD 0805: CAP 0805; Designer: Abbas Basereh; Desc.: CAP SMD 0805; Data: 16-12-2016
C78 = Cap ELECTROLITIC TOTAL SIZE: as C1 on sheet Sch_Z35; Data: 16-12-2016; Part. No: *
D25 = Diode SMD Package: Diode SMD Pakage
J6 = MOLEX_48037-0001: 4 Pin + 1 Shield USB Receptacle; Part Description: Right Angled Through Hole Shielded USB Plug, Type A; Manufacturer: MOLEX; PressFit: No; Part Number: MOLEX_48037-0001; Component Kind: Standard; Component Type: Standard; Pin Count: 6; Family: USB; Mounted: Yes; Socket: No; SMD: No; Sense: No; Status: None; Manufacturer Part Number: 48037-0001; ComponentHeight: 4.6mm; HelpURL: \\cern.ch\dfs\Applications\Altium\Datasheets\MOLEX_48037-0001.pdf; Author: CERN DEM JLC; CreateDate: 8/28/2014; LatestRevisionDate: 8/28/2014
P5 = Header 3: Header, 3-Pin; LatestRevisionDate: 17-Jul-2002; LatestRevisionNote: Re-released for DXP Platform.; Publisher: Altium Limited
P6 = Header 4: Header, 4-Pin; LatestRevisionDate: 17-Jul-2002; LatestRevisionNote: Re-released for DXP Platform.; Publisher: Altium Limited
U13 = SHT4X: Digital Relative Humidity Temperature Sensor, Â±1.8 / max 3.5 %RH, Â±0.2 Â°C, Ultra-Low-Power; MP: SHT40-AD1B-R2; MF: Sensirion; Purchase-URL: https://pricing.snapeda.com/search/part/SHT40-AD1B-R2/?ref=eda; Value: *; Availability: In Stock; Check_prices: https://www.snapeda.com/parts/SHT40-AD1B-R2/Sensirion/view-part/?ref=eda; SnapEDA_Link: https://www.snapeda.com/parts/SHT40-AD1B-R2/Sensirion/view-part/?ref=snap; Price: None; Package: None
UP4 = AMS1117-x.x: as UP1 on sheet Sch_Z35; Data: 16-12-2016

## Nets that join several sheets
3.3v: Sch_Z35 (36 pins), Sch_Z35_Wireless_board (27 pins)
+5: Sch_Z35 (22 pins), Sch_Z35_Wireless_board (10 pins), Sch_Z35_Sensors (6 pins)
GND: Sch_Z35_Wireless_board (52 pins), Sch_Z35_Sensors (8 pins)
+12v: Sch_Z35 (32 pins), Sch_Z35_Wireless_board (5 pins)
CE - NRF: Sch_Z35 (NRF1.3 U3.33), Sch_Z35_Wireless_board (IC11.23 NRF2.3)
CSN - NRF: Sch_Z35 (NRF1.4 U3.34), Sch_Z35_Wireless_board (IC11.24 NRF2.4)
IRQ - NRF: Sch_Z35 (NRF1.8 U3.26), Sch_Z35_Wireless_board (IC11.28 NRF2.8)
NRST: Sch_Z35 (C14.1 P1.5 R5.1 U3.7), Sch_Z35_Wireless_board (C52.1 IC11.10 P4.5 R45.1)
SDA: Sch_Z35_Wireless_board (IC11.48 R54.2 SHT1.2), Sch_Z35_Sensors (J6.2 U13.1)
SPI2 MISO: Sch_Z35 (NRF1.7 U3.36 U5.2), Sch_Z35_Wireless_board (IC11.26 NRF2.7)
SPI2 MOSI: Sch_Z35 (NRF1.6 U3.37 U5.5), Sch_Z35_Wireless_board (IC11.27 NRF2.6)
SPI2 SCK: Sch_Z35 (NRF1.5 U3.35 U5.6), Sch_Z35_Wireless_board (IC11.25 NRF2.5)
SWCLK: Sch_Z35 (P1.3 U3.50), Sch_Z35_Wireless_board (IC11.36 P4.3)
SWDIO: Sch_Z35 (P1.2 U3.49), Sch_Z35_Wireless_board (IC11.35 P4.2)
Tab 5v: Sch_Z35 (UP1.4), Sch_Z35_Wireless_board (M7.S UP3.4), Sch_Z35_Sensors (UP4.4)